# Altium project a0206-2006.PrjPcb (part 3 of 5)

## Sheet a0206-2006.9.SchDoc
size 558 x 431 mm
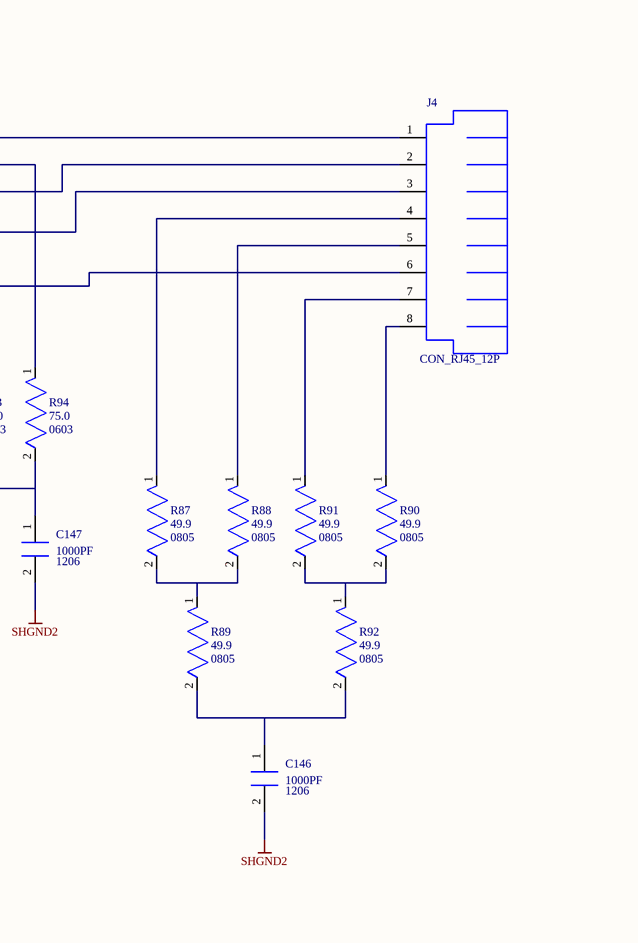
[diagram p27: a0206-2006.9.SchDoc, top right]
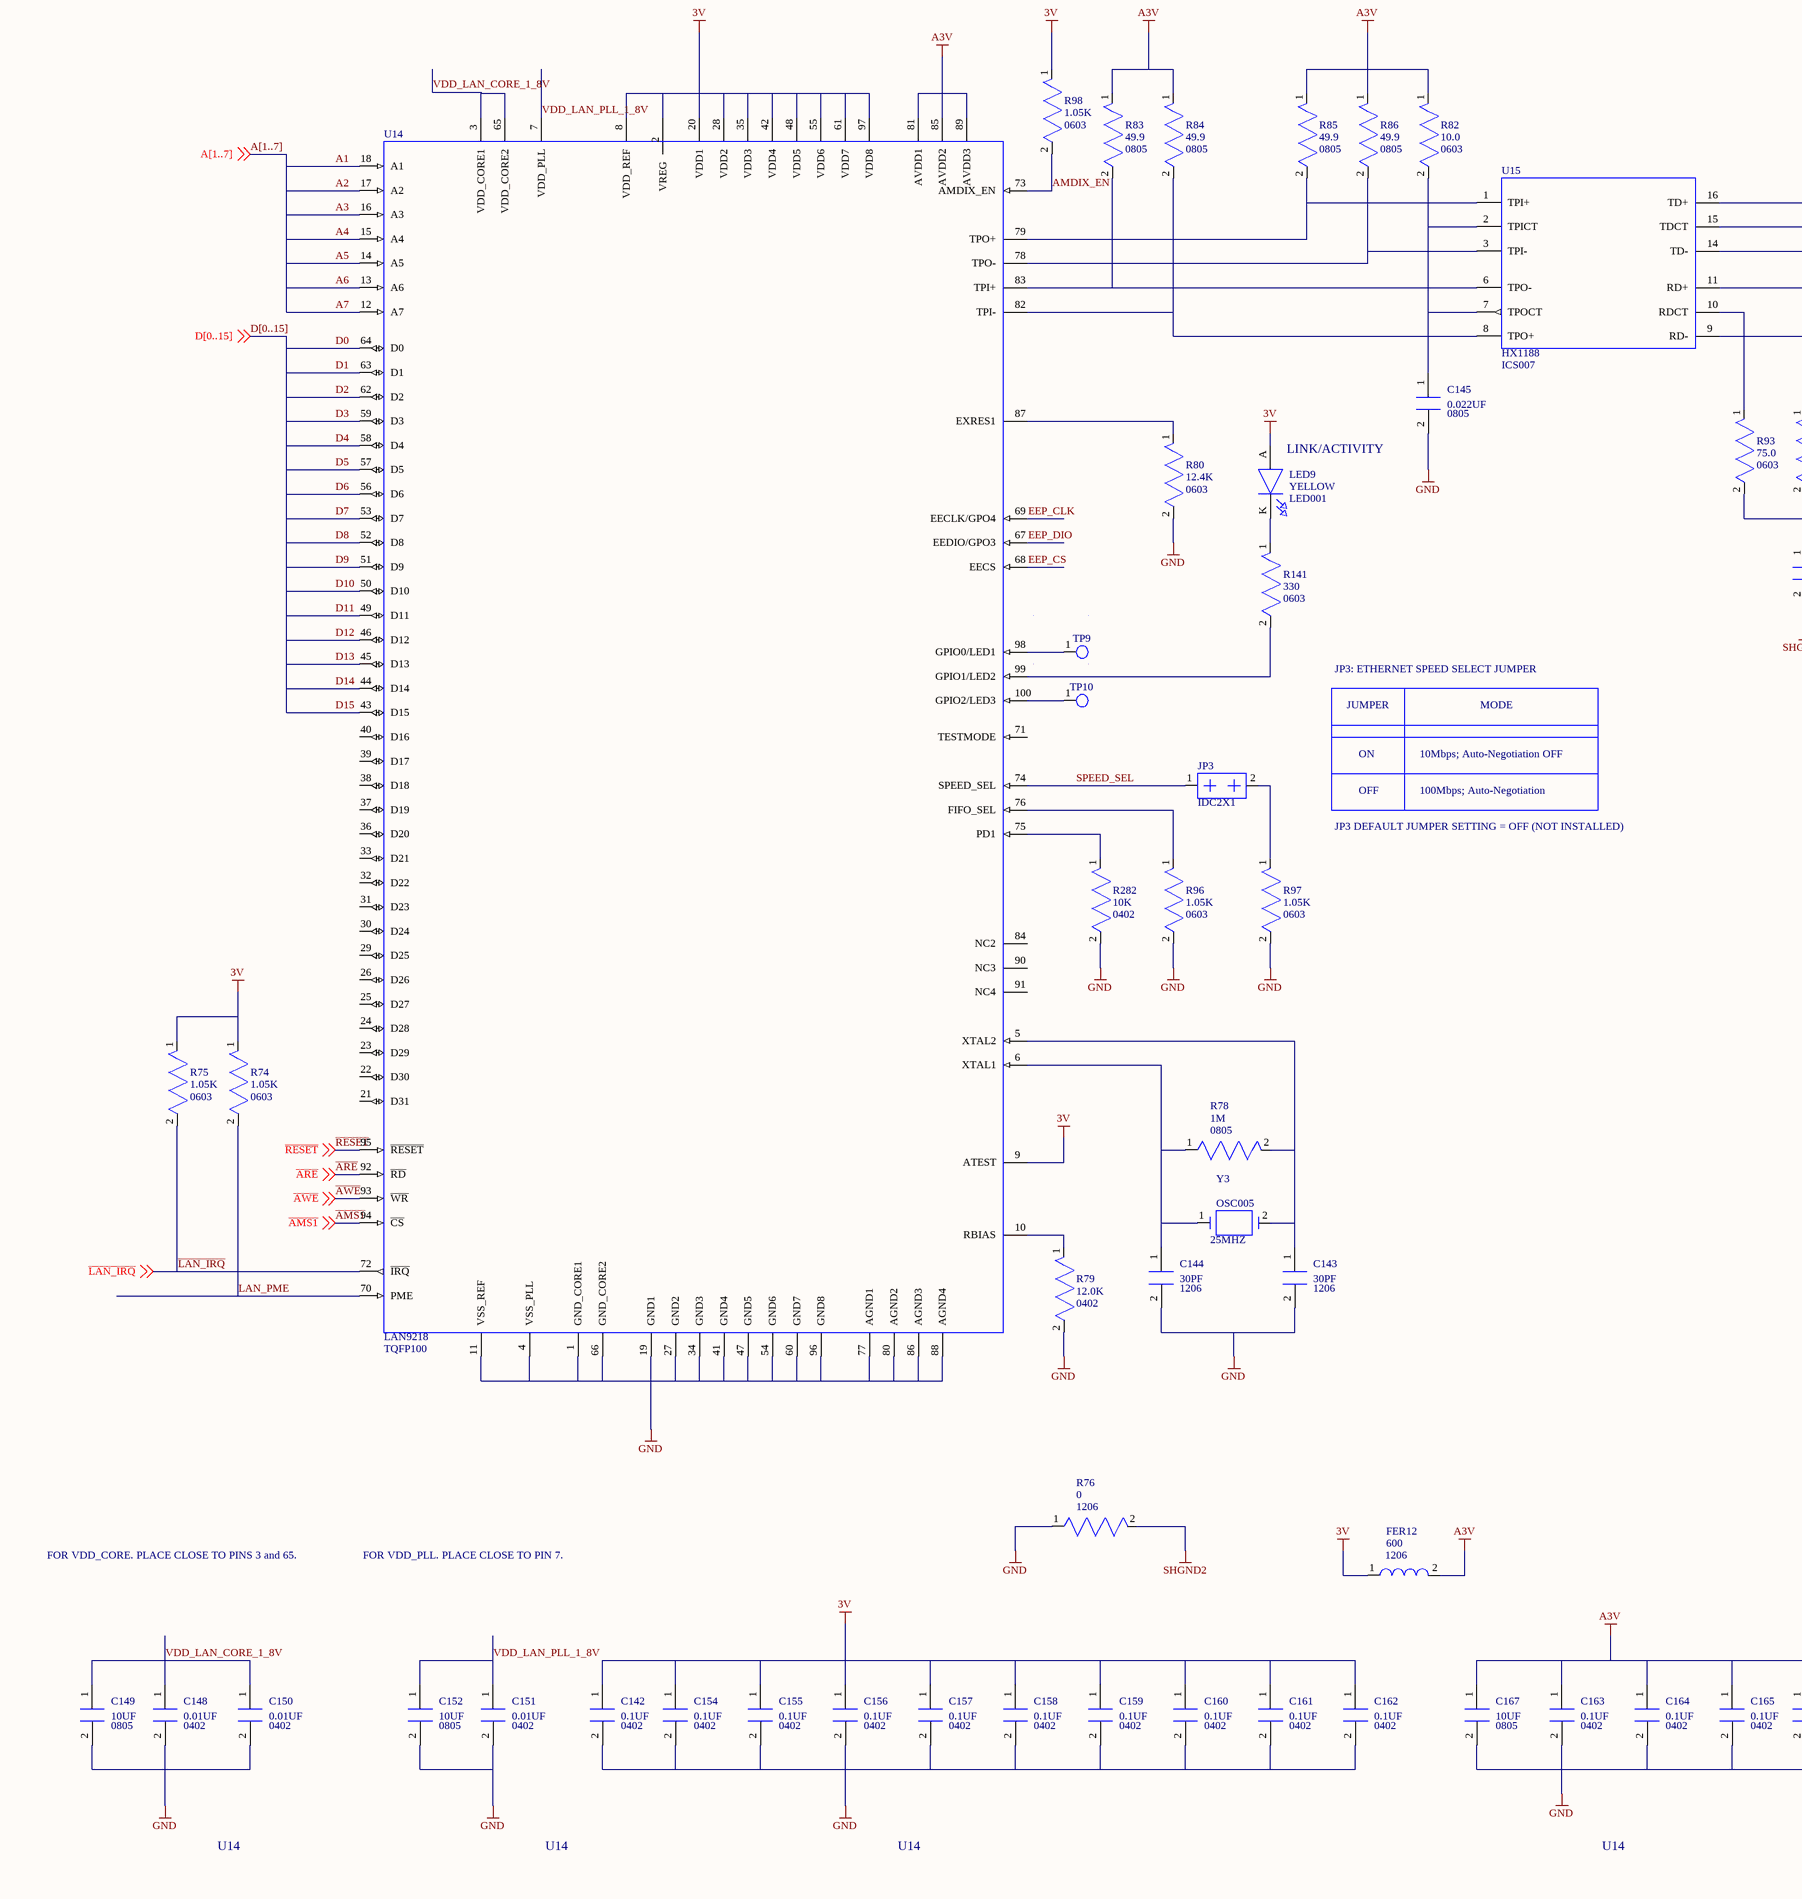
[diagram p28: a0206-2006.9.SchDoc, bottom left]
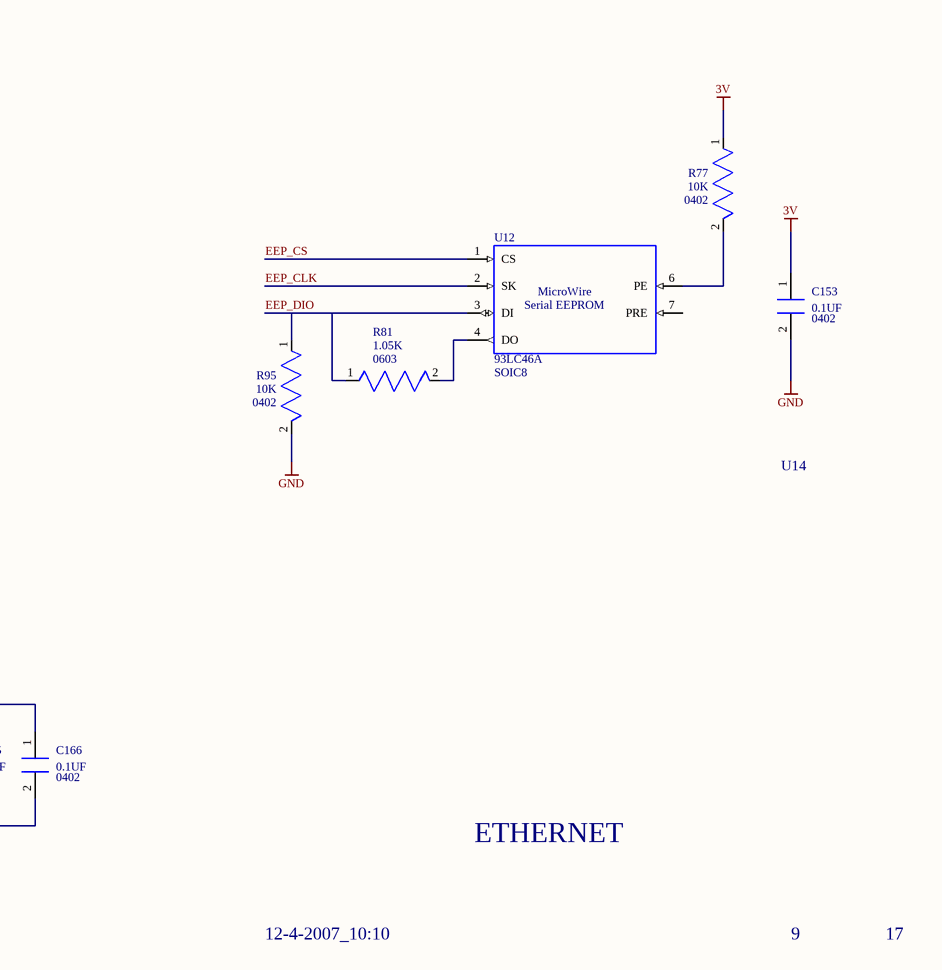
[diagram p29: a0206-2006.9.SchDoc, bottom right]

### Parts
C142  value 0.1UF  [0402]  (hidden comment: *)
C143  value 30PF  [1206]  (hidden comment: *)
C144  value 30PF  [1206]  (hidden comment: *)
C145  value 0.022UF  [0805]  (hidden comment: *)
C146  value 1000PF  [1206]  (hidden comment: *)
C147  value 1000PF  [1206]  (hidden comment: *)
C148  value 0.01UF  [0402]  (hidden comment: *)
C149  value 10UF  [0805]  (hidden comment: *)
C150  value 0.01UF  [0402]  (hidden comment: *)
C151  value 0.01UF  [0402]  (hidden comment: *)
C152  value 10UF  [0805]  (hidden comment: *)
C153  value 0.1UF  [0402]  (hidden comment: *)
C154  value 0.1UF  [0402]  (hidden comment: *)
C155  value 0.1UF  [0402]  (hidden comment: *)
C156  value 0.1UF  [0402]  (hidden comment: *)
C157  value 0.1UF  [0402]  (hidden comment: *)
C158  value 0.1UF  [0402]  (hidden comment: *)
C159  value 0.1UF  [0402]  (hidden comment: *)
C160  value 0.1UF  [0402]  (hidden comment: *)
C161  value 0.1UF  [0402]  (hidden comment: *)
C162  value 0.1UF  [0402]  (hidden comment: *)
C163  value 0.1UF  [0402]  (hidden comment: *)
C164  value 0.1UF  [0402]  (hidden comment: *)
C165  value 0.1UF  [0402]  (hidden comment: *)
C166  value 0.1UF  [0402]  (hidden comment: *)
C167  value 10UF  [0805]  (hidden comment: *)
FER12  value 600  [1206]  (hidden comment: *)
J4  *  [CON_RJ45_12P]  (value not drawn)
JP3  *  [IDC2X1]  (value not drawn)
LED9  value YELLOW  [LED001]  (hidden comment: *)
R74  value 1.05K  [0603]  (hidden comment: *)
R75  value 1.05K  [0603]  (hidden comment: *)
R76  value 0  [1206]  (hidden comment: *)
R77  value 10K  [0402]  (hidden comment: *)
R78  value 1M  [0805]  (hidden comment: *)
R79  value 12.0K  [0402]  (hidden comment: *)
R80  value 12.4K  [0603]  (hidden comment: *)
R81  value 1.05K  [0603]  (hidden comment: *)
R82  value 10.0  [0603]  (hidden comment: *)
R83  value 49.9  [0805]  (hidden comment: *)
R84  value 49.9  [0805]  (hidden comment: *)
R85  value 49.9  [0805]  (hidden comment: *)
R86  value 49.9  [0805]  (hidden comment: *)
R87  value 49.9  [0805]  (hidden comment: *)
R88  value 49.9  [0805]  (hidden comment: *)
R89  value 49.9  [0805]  (hidden comment: *)
R90  value 49.9  [0805]  (hidden comment: *)
R91  value 49.9  [0805]  (hidden comment: *)
R92  value 49.9  [0805]  (hidden comment: *)
R93  value 75.0  [0603]  (hidden comment: *)
R94  value 75.0  [0603]  (hidden comment: *)
R95  value 10K  [0402]  (hidden comment: *)
R96  value 1.05K  [0603]  (hidden comment: *)
R97  value 1.05K  [0603]  (hidden comment: *)
R98  value 1.05K  [0603]  (hidden comment: *)
R141  value 330  [0603]  (hidden comment: *)
R282  value 10K  [0402]  (hidden comment: *)
TP9  *  [TP]  (value not drawn)
TP10  *  [TP]  (value not drawn)
U12  PART: 93LC46A  [SOIC8]  (hidden comment: *)
U14  PART: LAN9218  [TQFP100]  (hidden comment: *)
U15  PART: HX1188  [ICS007]  (hidden comment: *)
Y3  value 25MHZ  [OSC005]  (hidden comment: *)

### Nets
3V: C142.1(A) C153.1(A) C154.1(A) C155.1(A) C156.1(A) C157.1(A) C158.1(A) C159.1(A) C160.1(A) C161.1(A) C162.1(A) FER12.1(A) LED9.A(ANODE) R74.1(N1) R75.1(N1) R77.1(N1) R98.1(N1) U12.8(3V) U14.2(VREG) U14.8(VDD_REF) U14.9(ATEST) U14.20(VDD1) U14.28(VDD2) U14.35(VDD3) U14.42(VDD4) U14.48(VDD5) U14.55(VDD6) U14.61(VDD7) U14.97(VDD8)
A3V: C163.1(A) C164.1(A) C165.1(A) C166.1(A) C167.1(A) FER12.2(B) R82.1(N1) R83.1(N1) R84.1(N1) R85.1(N1) R86.1(N1) U14.81(AVDD1) U14.85(AVDD2) U14.89(AVDD3)
GND: C142.2(B) C143.2(B) C144.2(B) C145.2(B) C148.2(B) C149.2(B) C150.2(B) C151.2(B) C152.2(B) C153.2(B) C154.2(B) C155.2(B) C156.2(B) C157.2(B) C158.2(B) C159.2(B) C160.2(B) C161.2(B) C162.2(B) C163.2(B) C164.2(B) C165.2(B) C166.2(B) C167.2(B) R76.1(N1) R79.2(N2) R80.2(N2) R95.2(N2) R96.2(N2) R97.2(N2) R282.2(N2) U12.5(GND) U14.1(GND_CORE1) U14.4(VSS_PLL) U14.11(VSS_REF) U14.19(GND1) U14.27(GND2) U14.34(GND3) U14.41(GND4) U14.47(GND5) U14.54(GND6) U14.60(GND7) U14.66(GND_CORE2) U14.77(AGND1) U14.80(AGND2) U14.86(AGND3) U14.88(AGND4) U14.96(GND8)
SHGND2: C146.2(B) C147.2(B) J4.11(SHGND2) J4.12(SHGND2) R76.2(N2)
A1: U14.18(A1)
A2: U14.17(A2)
A3: U14.16(A3)
A4: U14.15(A4)
A5: U14.14(A5)
A6: U14.13(A6)
A7: U14.12(A7)
~{AMS1}: U14.94(~{CS}) ; off-sheet ~{AMS1}
~{ARE}: U14.92(~{RD}) ; off-sheet ~{ARE}
~{AWE}: U14.93(~{WR}) ; off-sheet ~{AWE}
AMDIX_EN: R98.2(N2) U14.73(AMDIX_EN)
D0: U14.64(D0)
D1: U14.63(D1)
D2: U14.62(D2)
D3: U14.59(D3)
D4: U14.58(D4)
D5: U14.57(D5)
D6: U14.56(D6)
D7: U14.53(D7)
D8: U14.52(D8)
D9: U14.51(D9)
D10: U14.50(D10)
D11: U14.49(D11)
D12: U14.46(D12)
D13: U14.45(D13)
D14: U14.44(D14)
D15: U14.43(D15)
EEP_CLK: U12.2(SK) U14.69(EECLK/GPO4)
EEP_CS: U12.1(CS) U14.68(EECS)
EEP_DIO: R81.1(N1) R95.1(N1) U12.3(DI) U14.67(EEDIO/GPO3)
~{LAN_IRQ}: R75.2(N2) U14.72(~{IRQ}) ; off-sheet ~{LAN_IRQ}
LAN_PME: R74.2(N2) U14.70(PME)
~{RESET}: U14.95(~{RESET}) ; off-sheet ~{RESET}
SPEED_SEL: JP3.1 U14.74(SPEED_SEL)
VDD_LAN_CORE_1_8V: C148.1(A) C149.1(A) C150.1(A) U14.3(VDD_CORE1) U14.65(VDD_CORE2)
VDD_LAN_PLL_1_8V: C151.1(A) C152.1(A) U14.7(VDD_PLL)
NetC143_1: C143.1(A) R78.2(N2) U14.5(XTAL2) Y3.2(N2)
NetC144_1: C144.1(A) R78.1(N1) U14.6(XTAL1) Y3.1(N1)
NetC145_1: C145.1(A) R82.2(N2) U15.2(TPICT) U15.7(TPOCT)
NetC146_1: C146.1(A) R89.2(N2) R92.2(N2)
NetC147_1: C147.1(A) R93.2(N2) R94.2(N2)
NetJ4_1: J4.1 U15.16(TD+)
NetJ4_2: J4.2 U15.14(TD-)
NetJ4_3: J4.3 U15.11(RD+)
NetJ4_4: J4.4 R87.1(N1)
NetJ4_5: J4.5 R88.1(N1)
NetJ4_6: J4.6 U15.9(RD-)
NetJ4_7: J4.7 R91.1(N1)
NetJ4_8: J4.8 R90.1(N1)
NetJP3_2: JP3.2 R97.1(N1)
NetLED9_K: LED9.K(CATHODE) R141.1(N1)
NetR77_2: R77.2(N2) U12.6(PE)
NetR79_1: R79.1(N1) U14.10(RBIAS)
NetR80_1: R80.1(N1) U14.87(EXRES1)
NetR81_2: R81.2(N2) U12.4(DO)
NetR83_2: R83.2(N2) U14.83(TPI+) U15.6(TPO-)
NetR84_2: R84.2(N2) U14.82(TPI-) U15.8(TPO+)
NetR85_2: R85.2(N2) U14.79(TPO+) U15.1(TPI+)
NetR86_2: R86.2(N2) U14.78(TPO-) U15.3(TPI-)
NetR87_2: R87.2(N2) R88.2(N2) R89.1(N1)
NetR90_2: R90.2(N2) R91.2(N2) R92.1(N1)
NetR93_1: R93.1(N1) U15.10(RDCT)
NetR94_1: R94.1(N1) U15.15(TDCT)
NetR96_1: R96.1(N1) U14.76(FIFO_SEL)
NetR141_2: R141.2(N2) U14.99(GPIO1/LED2)
NetR282_1: R282.1(N1) U14.75(PD1)
NetTP9_1: TP9.1(TP) U14.98(GPIO0/LED1)
NetTP10_1: TP10.1(TP) U14.100(GPIO2/LED3)

Not connected (* = marked no-connect by the designer): J4 9 10; U12 7(PRE); U14 21(D31) 22(D30) 23(D29) 24(D28) 25(D27) 26(D26) 29(D25) 30(D24) 31(D23) 32(D22) 33(D21) 36(D20) 37(D19) 38(D18) 39(D17) 40(D16) 71(TESTMODE) 84(NC2) 90(NC3) 91(NC4); U15 4 5 12 13

### Buses and harness runs
bus A[1..7]
bus D[0..15]

### Notes on the sheet
- (near LED9) LINK/ACTIVITY
- JP3: ETHERNET SPEED SELECT JUMPER
- JUMPER
- MODE
- OFF
- ON
- 10Mbps; Auto-Negotiation OFF
- 100Mbps; Auto-Negotiation
- JP3 DEFAULT JUMPER SETTING = OFF (NOT INSTALLED)
- U14
- FOR VDD_CORE. PLACE CLOSE TO PINS 3 and 65.
- FOR VDD_PLL. PLACE CLOSE TO PIN 7.
- ETHERNET
- 12-4-2007_10:10
- 9
- 17
- A
- B
- C
- D
- 1
- 2
- 3
- 20 Cotton Road
- 4
- DEVICES
- ANALOG
- Nashua, NH 03063
- PH: 1-800-ANALOGD
- Title
- ADSP-BF548 EZ-KIT LITE
- Size
- Board No.
- A0206-2006
- Rev
- 1.4B
- Date
- Sheet
- of
- (in symbol ICS_93CSXXL.1) MicroWire; Serial EEPROM

### Library data of the parts
C142 C155 C157 C159 C161 C163 C165 = CAP_NON_POLARIZED.2: PART_SPEC: CAPACITOR; LEVEL: STD; TYPE: X5R; PRT_NUM: 7000278; VOLTAGE: 10V; TOLERANCE: 10%; PKG_TYPE: 0402; ROHS: ROHS
C143 C144 = CAP_NON_POLARIZED.2: PART_SPEC: CAPACITOR; LEVEL: STD; TYPE: NPO; PRT_NUM: 7000150; VOLTAGE: 100V; TOLERANCE: 5%; PKG_TYPE: 1206; ROHS: ROHS
C145 = CAP_NON_POLARIZED.2: PART_SPEC: CAPACITOR; LEVEL: STD; PRT_NUM: 7000331; TYPE: X7R; VOLTAGE: 50V; TOLERANCE: 5%; PKG_TYPE: 0805; ROHS: ROHS
C146 = CAP_NON_POLARIZED.2: PART_SPEC: CAPACITOR; LEVEL: STD; PRT_NUM: 7000572; TOLERANCE: 10%; VOLTAGE: 2000V; TYPE: X7R LOW_ESR; PKG_TYPE: 1206; ROHS: ROHS
C147 = CAP_NON_POLARIZED.2: PART_SPEC: CAPACITOR; LEVEL: STD; PRT_NUM: 7000572; TYPE: X7R LOW_ESR; VOLTAGE: 2000V; TOLERANCE: 10%; PKG_TYPE: 1206; ROHS: ROHS
C148 = CAP_NON_POLARIZED.2: PART_SPEC: CAPACITOR; LEVEL: STD; PRT_NUM: 7000279; VOLTAGE: 16V; TOLERANCE: 10%; TYPE: X7R; PKG_TYPE: 0402; ROHS: ROHS
C149 = CAP_NON_POLARIZED.2: PART_SPEC: CAPACITOR; LEVEL: STD; TOLERANCE: 10%; VOLTAGE: 6.3V; PRT_NUM: 7000265; TYPE: X5R; PKG_TYPE: 0805; ROHS: ROHS
C150 C151 = CAP_NON_POLARIZED.2: PART_SPEC: CAPACITOR; LEVEL: STD; TYPE: X7R; TOLERANCE: 10%; VOLTAGE: 16V; PRT_NUM: 7000279; PKG_TYPE: 0402; ROHS: ROHS
C152 C167 = CAP_NON_POLARIZED.2: PART_SPEC: CAPACITOR; LEVEL: STD; TYPE: X5R; PRT_NUM: 7000265; VOLTAGE: 6.3V; TOLERANCE: 10%; PKG_TYPE: 0805; ROHS: ROHS
C153 = CAP_NON_POLARIZED.2: PART_SPEC: CAPACITOR; LEVEL: STD; PRT_NUM: 7000278; VOLTAGE: 10V; TOLERANCE: 10%; TYPE: X5R; PKG_TYPE: 0402; ROHS: ROHS
C154 C156 C158 C160 C162 C164 C166 = CAP_NON_POLARIZED.2: PART_SPEC: CAPACITOR; LEVEL: STD; TOLERANCE: 10%; VOLTAGE: 10V; PRT_NUM: 7000278; TYPE: X5R; PKG_TYPE: 0402; ROHS: ROHS
FER12 = FER_STANDARD.1: PART_SPEC: FERRITE; LEVEL: STD; FREQ: 100MHZ; PRT_NUM: 7000117; CURRENT: 500MA; PKG_TYPE: 1206; ROHS: ROHS
J4 = CON_RJ45_12P.1: RA; PART_SPEC: CONNECTOR; LEVEL: STD; NC: 9,10; CONFIGURATION: 8PIN; PRT_NUM: 6000830; PKG_TYPE: CON_RJ45_12P; ROHS: ROHS; TYPE: RJ45
JP3 = CON_2X1.2: HEADER; PART_SPEC: CONNECTOR; LEVEL: STD; PRT_NUM: 6000774; CONFIGURATION: 2X1; PKG_TYPE: IDC2X1; TYPE: IDC; ROHS: ROHS
LED9 = LED_STANDARD.3: GULL-WING; PART_SPEC: LED; LEVEL: STD; PD1: AMBER-SMT; PRT_NUM: 7000027; PKG_TYPE: LED001; ROHS: ROHS
R74 = RES_STANDARD.2: PART_SPEC: RESISTOR; LEVEL: STD; POWER: 1/16W; PRT_NUM: 7000458; TOLERANCE: 1%; PKG_TYPE: 0603; ROHS: ROHS
R75 R96 R98 = RES_STANDARD.2: PART_SPEC: RESISTOR; LEVEL: STD; POWER: 1/16W; TOLERANCE: 1%; PRT_NUM: 7000458; PKG_TYPE: 0603; ROHS: ROHS
R76 = RES_STANDARD.1: PART_SPEC: RESISTOR; LEVEL: STD; POWER: 1/4W; PRT_NUM: 7000021; TOLERANCE: 5%; PKG_TYPE: 1206; ROHS: ROHS
R77 = RES_STANDARD.2: PART_SPEC: RESISTOR; LEVEL: STD; POWER: 1/16W; TOLERANCE: 5%; PRT_NUM: 7000280; PKG_TYPE: 0402; ROHS: ROHS
R78 = RES_STANDARD.1: PART_SPEC: RESISTOR; LEVEL: STD; POWER: 1/10W; PRT_NUM: 7000046; TOLERANCE: 5%; PKG_TYPE: 0805; ROHS: ROHS
R79 = RES_STANDARD.2: PART_SPEC: RESISTOR; LEVEL: STD; PRT_NUM: 7000543; TOLERANCE: 1%; POWER: 1/16W; PKG_TYPE: 0402; ROHS: ROHS
R80 = RES_STANDARD.2: PART_SPEC: RESISTOR; LEVEL: STD; PRT_NUM: 7000410; POWER: 1/10W; TOLERANCE: 1%; PKG_TYPE: 0603; ROHS: ROHS
R81 = RES_STANDARD.1: PART_SPEC: RESISTOR; LEVEL: STD; TOLERANCE: 1%; PRT_NUM: 7000458; POWER: 1/16W; PKG_TYPE: 0603; ROHS: ROHS
R82 = RES_STANDARD.2: PART_SPEC: RESISTOR; LEVEL: STD; PRT_NUM: 7000580; POWER: 1/10W; TOLERANCE: 1%; PKG_TYPE: 0603; ROHS: ROHS
R83 R85 R87 R89 R90 = RES_STANDARD.2: PART_SPEC: RESISTOR; LEVEL: STD; TOLERANCE: 1%; PRT_NUM: 7000335; POWER: 1/10W; PKG_TYPE: 0805; ROHS: ROHS
R84 R86 R88 R91 R92 = RES_STANDARD.2: PART_SPEC: RESISTOR; LEVEL: STD; POWER: 1/10W; PRT_NUM: 7000335; TOLERANCE: 1%; PKG_TYPE: 0805; ROHS: ROHS
R93 = RES_STANDARD.2: PART_SPEC: RESISTOR; LEVEL: STD; PRT_NUM: 7000417; POWER: 1/10W; TOLERANCE: 1%; PKG_TYPE: 0603; ROHS: ROHS
R94 = RES_STANDARD.2: PART_SPEC: RESISTOR; LEVEL: STD; TOLERANCE: 1%; POWER: 1/10W; PRT_NUM: 7000417; PKG_TYPE: 0603; ROHS: ROHS
R95 = RES_STANDARD.2: PART_SPEC: RESISTOR; LEVEL: STD; PRT_NUM: 7000280; TOLERANCE: 5%; POWER: 1/16W; PKG_TYPE: 0402; ROHS: ROHS
R97 = RES_STANDARD.2: PART_SPEC: RESISTOR; LEVEL: STD; PRT_NUM: 7000458; TOLERANCE: 1%; POWER: 1/16W; PKG_TYPE: 0603; ROHS: ROHS
R141 = RES_STANDARD.2: PART_SPEC: RESISTOR; LEVEL: STD; POWER: 1/10W; PRT_NUM: 7000368; TOLERANCE: 5%; PKG_TYPE: 0603; ROHS: ROHS
R282 = RES_STANDARD.2: as R56 on sheet a0206-2006.7; PKG_TYPE: 0402; ROHS: ROHS
TP9 TP10 = MSC_TEST_POINT.2: TESTPOINT; CLASS: DNP; LEVEL: STD; PART_SPEC: TESTPOINT; PART: TESTPOINT; ROHS: ROHS; PKG_TYPE: TP
U12 = ICS_93CSXXL.1: 1K (128X8) SERIAL ROM; LEVEL: STD; PRT_NUM: 1000444; PKG_TYPE: SOIC8; WEB: http://ww1.microchip.com/downloads/en/DeviceDoc/21749F.pdf; ROHS: ROHS
U14 = ICS_LAN9218.1: 10/100 ETHERNET CONTROLLE; LEVEL: STD; PRT_NUM: 1000421; PKG_TYPE: TQFP100; ROHS: ROHS; WEB: http://www.smsc.com/main/catalog/lan9218.html
U15 = ICS_HX1188.1: MAGNETIC FOR ETHERNET; NC: 4,5,12,13; LEVEL: STD; PRT_NUM: 1000420; PKG_TYPE: ICS007; ROHS: ROHS; WEB: http://www.pulseeng.com/products/datasheets/H325.pdf
Y3 = OSC_CRYSTAL.1: CRYSTAL; LEVEL: STD; PD2: SMT; PRT_NUM: 1000139; PART_SPEC: CRYSTAL; PKG_TYPE: OSC005; ROHS: ROHS; VOLTAGE: SMT

## Sheet a0206-2006.10.SchDoc
size 558 x 431 mm
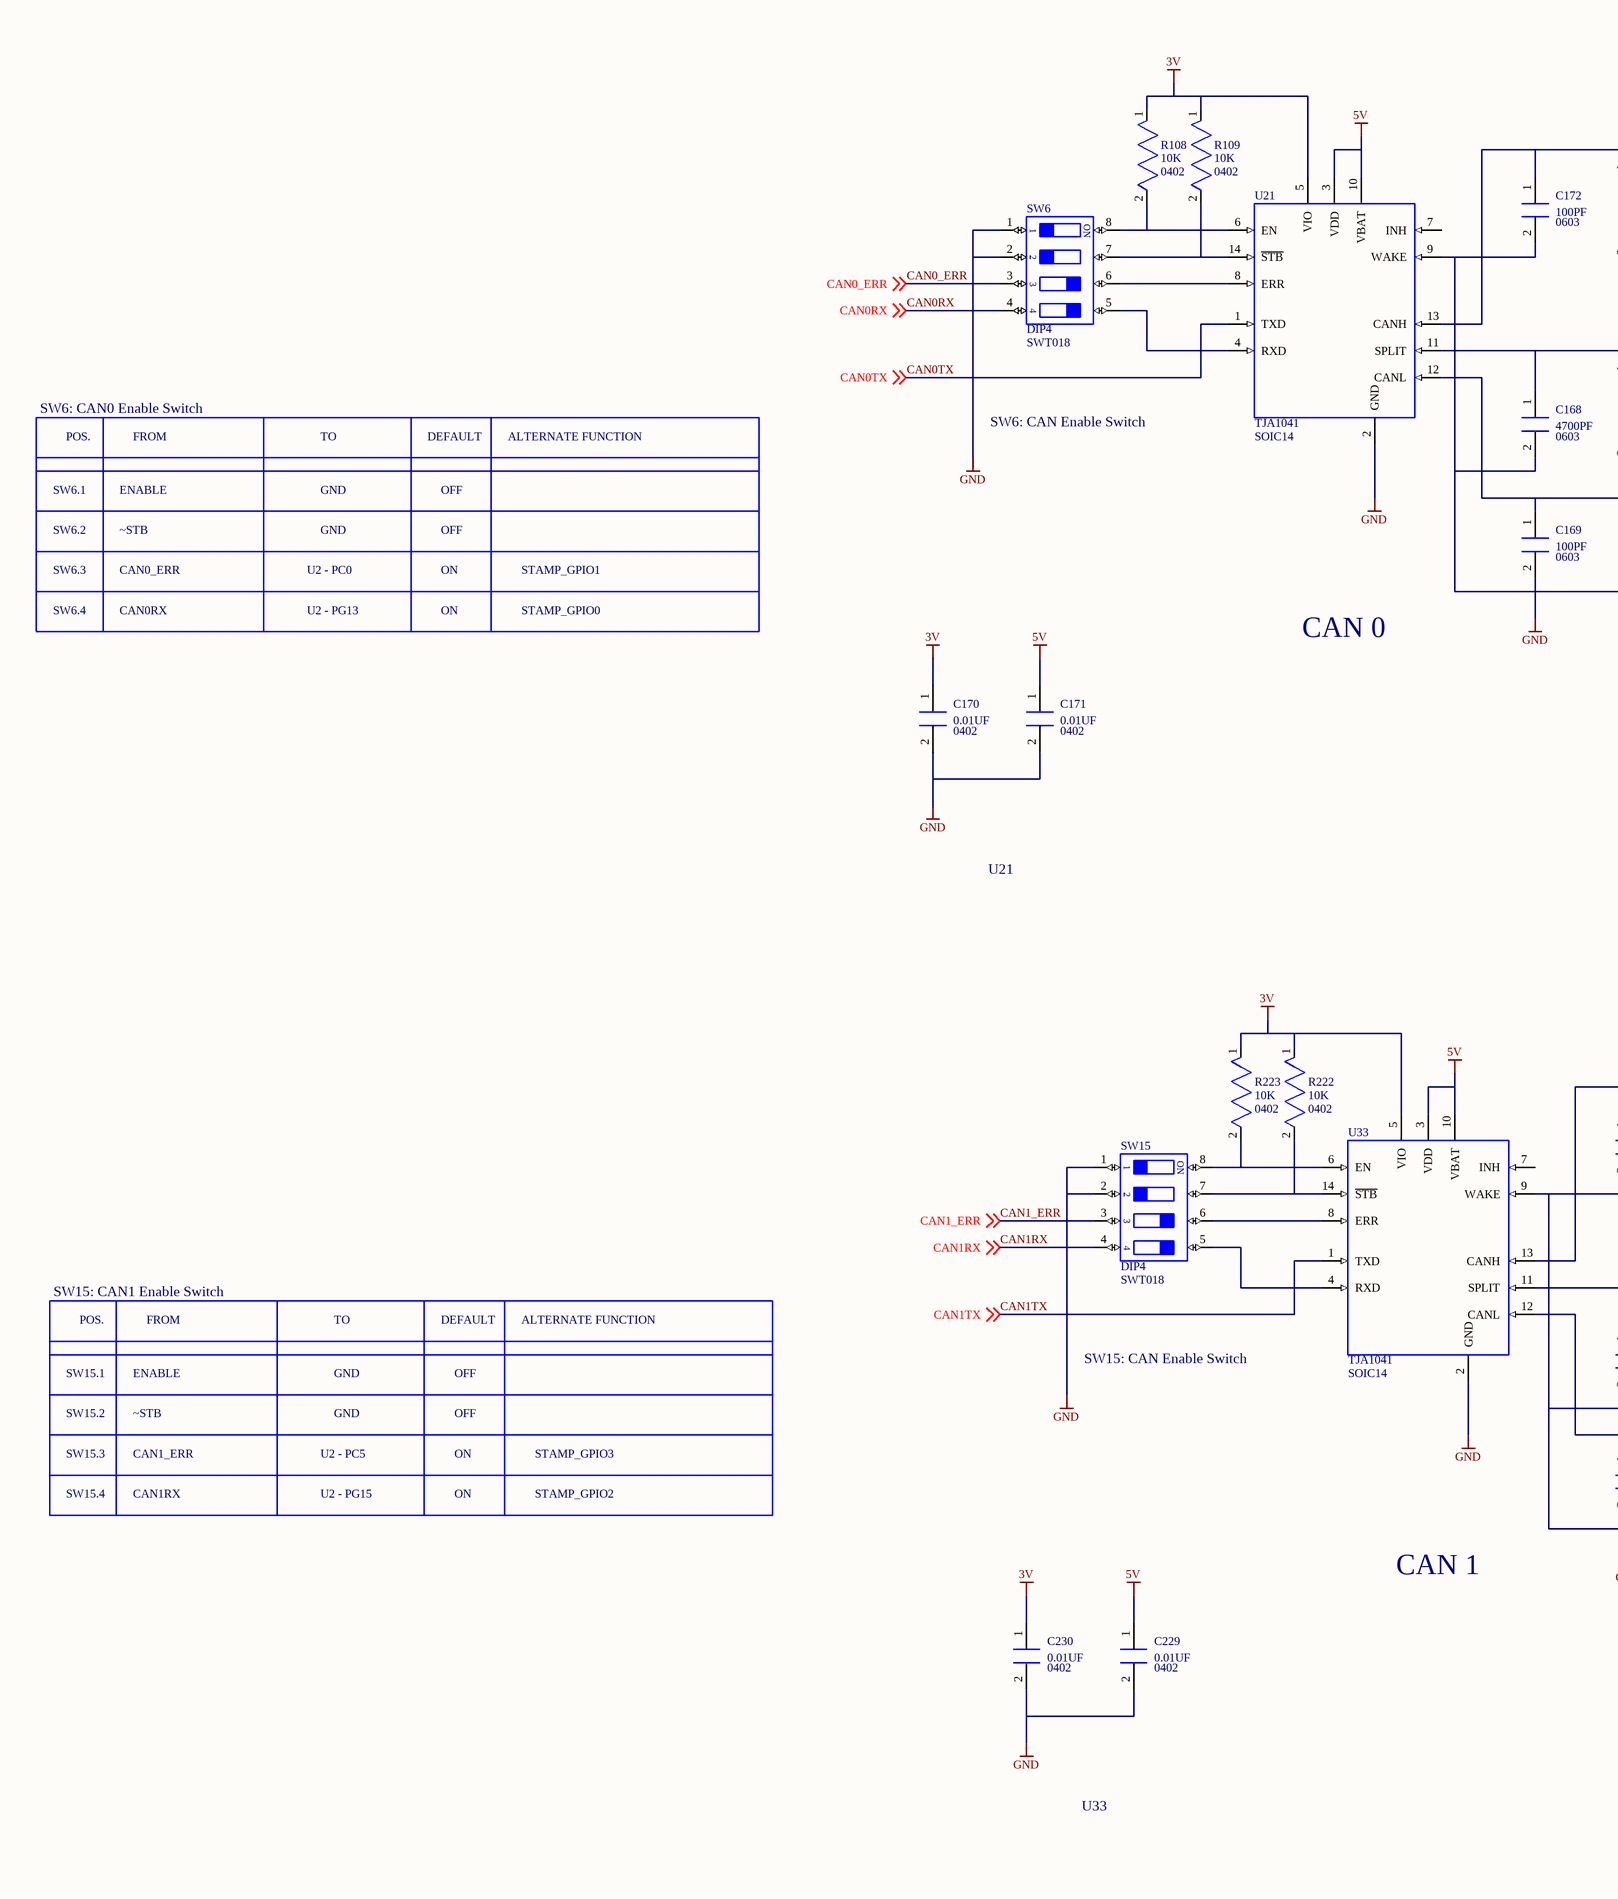
[diagram p30: a0206-2006.10.SchDoc, left]
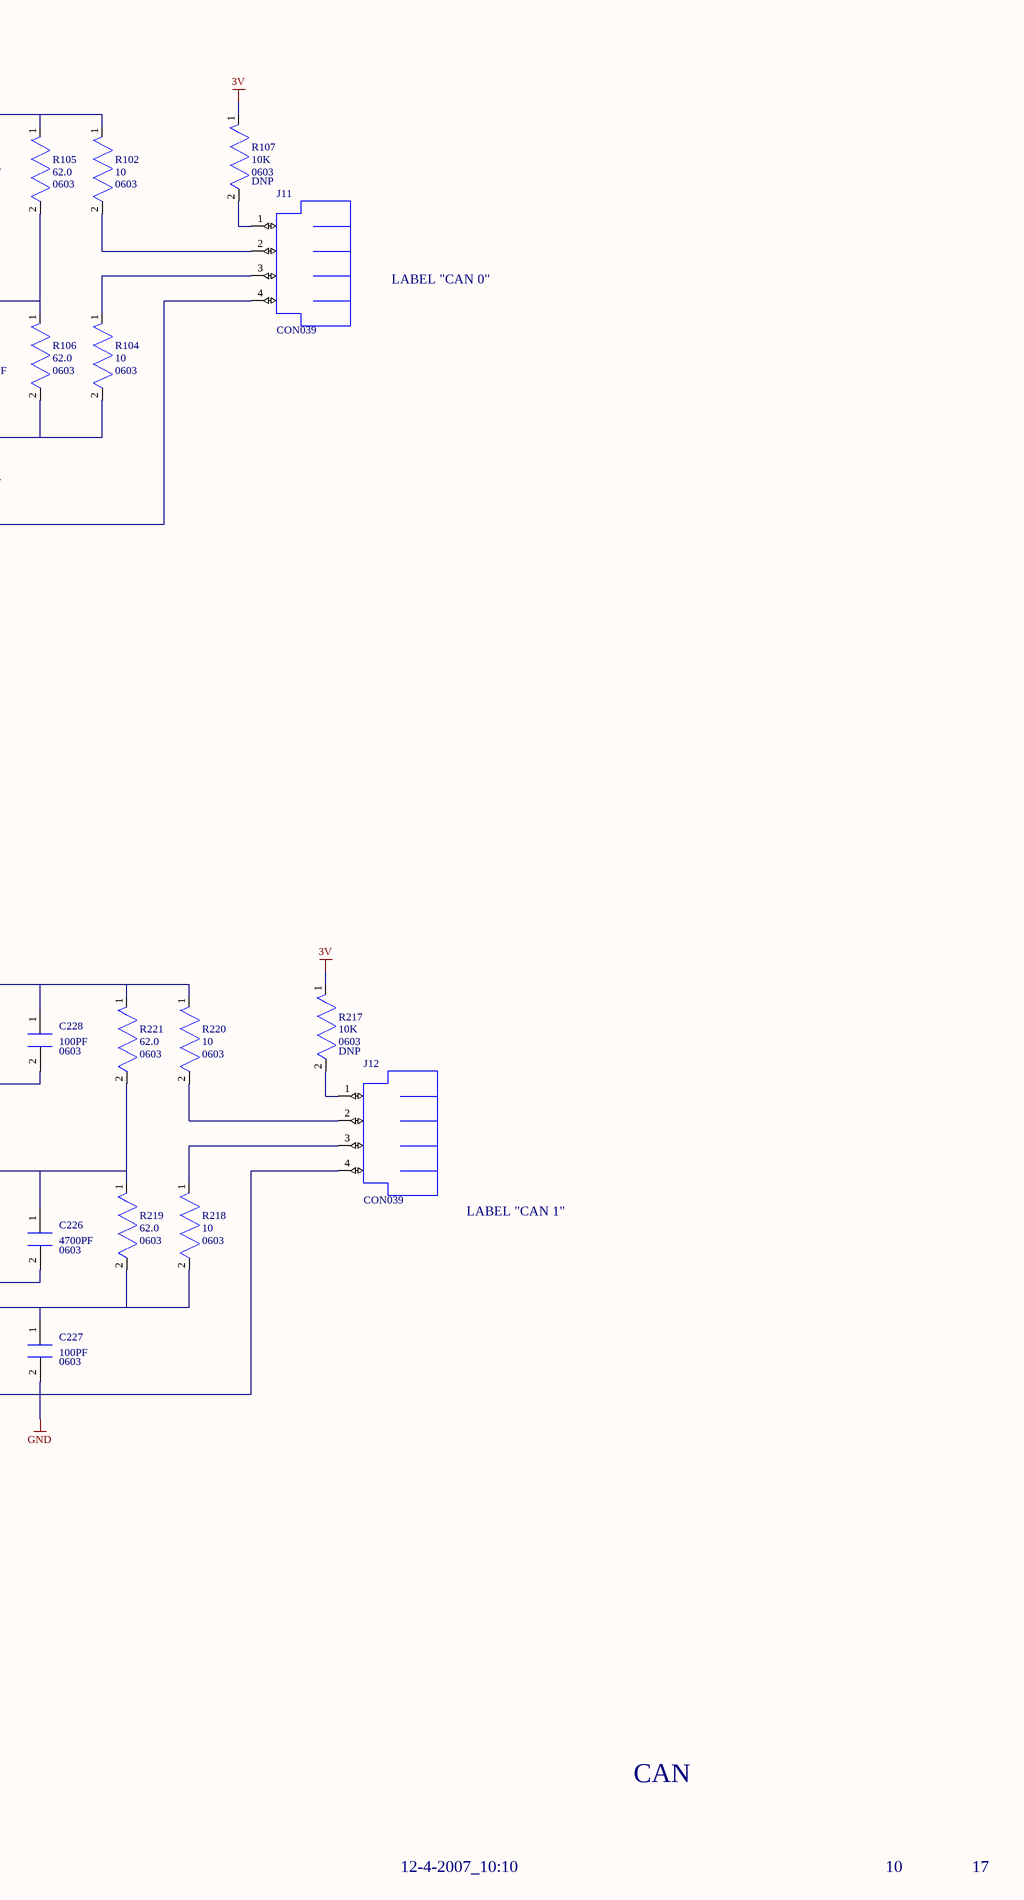
[diagram p31: a0206-2006.10.SchDoc, right]

### Parts
C168  value 4700PF  [0603]  (hidden comment: *)
C169  value 100PF  [0603]  (hidden comment: *)
C170  value 0.01UF  [0402]  (hidden comment: *)
C171  value 0.01UF  [0402]  (hidden comment: *)
C172  value 100PF  [0603]  (hidden comment: *)
C226  value 4700PF  [0603]  (hidden comment: *)
C227  value 100PF  [0603]  (hidden comment: *)
C228  value 100PF  [0603]  (hidden comment: *)
C229  value 0.01UF  [0402]  (hidden comment: *)
C230  value 0.01UF  [0402]  (hidden comment: *)
J11  *  [CON039]  (value not drawn)
J12  *  [CON039]  (value not drawn)
R102  value 10  [0603]  (hidden comment: *)
R104  value 10  [0603]  (hidden comment: *)
R105  value 62.0  [0603]  (hidden comment: *)
R106  value 62.0  [0603]  (hidden comment: *)
R107  value 10K  CLASS: DNP  [0603]  (hidden comment: *)
R108  value 10K  [0402]  (hidden comment: *)
R109  value 10K  [0402]  (hidden comment: *)
R217  value 10K  CLASS: DNP  [0603]  (hidden comment: *)
R218  value 10  [0603]  (hidden comment: *)
R219  value 62.0  [0603]  (hidden comment: *)
R220  value 10  [0603]  (hidden comment: *)
R221  value 62.0  [0603]  (hidden comment: *)
R222  value 10K  [0402]  (hidden comment: *)
R223  value 10K  [0402]  (hidden comment: *)
SW6  value DIP4  [SWT018]  (hidden comment: *)
SW15  value DIP4  [SWT018]  (hidden comment: *)
U21  PART: TJA1041  [SOIC14]  (hidden comment: *)
U33  PART: TJA1041  [SOIC14]  (hidden comment: *)

### Nets
3V: C170.1(A) C230.1(A) R107.1(N1) R108.1(N1) R109.1(N1) R217.1(N1) R222.1(N1) R223.1(N1) U21.5(VIO) U33.5(VIO)
5V: C171.1(A) C229.1(A) U21.3(VDD) U21.10(VBAT) U33.3(VDD) U33.10(VBAT)
GND: C168.2(B) C169.2(B) C170.2(B) C171.2(B) C172.2(B) C226.2(B) C227.2(B) C228.2(B) C229.2(B) C230.2(B) J11.4 J12.4 SW6.1 SW6.2 SW15.1 SW15.2 U21.2(GND) U21.9(WAKE) U33.2(GND) U33.9(WAKE)
CAN0_ERR: SW6.3 ; off-sheet CAN0_ERR
CAN0RX: SW6.4 ; off-sheet CAN0RX
CAN0TX: U21.1(TXD) ; off-sheet CAN0TX
CAN1_ERR: SW15.3 ; off-sheet CAN1_ERR
CAN1RX: SW15.4 ; off-sheet CAN1RX
CAN1TX: U33.1(TXD) ; off-sheet CAN1TX
NetC168_1: C168.1(A) R105.2(N2) R106.1(N1) U21.11(SPLIT)
NetC169_1: C169.1(A) R104.2(N2) R106.2(N2) U21.12(CANL)
NetC172_1: C172.1(A) R102.1(N1) R105.1(N1) U21.13(CANH)
NetC226_1: C226.1(A) R219.1(N1) R221.2(N2) U33.11(SPLIT)
NetC227_1: C227.1(A) R218.2(N2) R219.2(N2) U33.12(CANL)
NetC228_1: C228.1(A) R220.1(N1) R221.1(N1) U33.13(CANH)
NetJ11_1: J11.1 R107.2(N2)
NetJ11_2: J11.2 R102.2(N2)
NetJ11_3: J11.3 R104.1(N1)
NetJ12_1: J12.1 R217.2(N2)
NetJ12_2: J12.2 R220.2(N2)
NetJ12_3: J12.3 R218.1(N1)
NetR108_2: R108.2(N2) SW6.8 U21.6(EN)
NetR109_2: R109.2(N2) SW6.7 U21.14(~{STB})
NetR222_2: R222.2(N2) SW15.7 U33.14(~{STB})
NetR223_2: R223.2(N2) SW15.8 U33.6(EN)
NetSW6_5: SW6.5 U21.4(RXD)
NetSW6_6: SW6.6 U21.8(ERR)
NetSW15_5: SW15.5 U33.4(RXD)
NetSW15_6: SW15.6 U33.8(ERR)

Not connected (* = marked no-connect by the designer): U21 7(INH); U33 7(INH)

### Notes on the sheet
- LABEL "CAN 0"
- SW6: CAN0 Enable Switch
- POS.
- FROM
- TO
- DEFAULT
- ALTERNATE FUNCTION
- SW6: CAN Enable Switch
- SW6.1
- ENABLE
- GND
- OFF
- SW6.2
- SW6.3
- ~STB
- CAN0_ERR
- U2 - PC0
- ON
- STAMP_GPIO1
- SW6.4
- CAN0RX
- U2 - PG13
- STAMP_GPIO0
- CAN 0
- U21
- SW15: CAN1 Enable Switch
- SW15.1
- SW15: CAN Enable Switch
- LABEL "CAN 1"
- SW15.2
- SW15.3
- CAN1_ERR
- U2 - PC5
- STAMP_GPIO3
- SW15.4
- CAN1RX
- U2 - PG15
- STAMP_GPIO2
- CAN 1
- U33
- CAN
- 12-4-2007_10:10
- 10
- 17
- A
- B
- C
- D
- 1
- 2
- 3
- 20 Cotton Road
- 4
- DEVICES
- ANALOG
- Nashua, NH 03063
- PH: 1-800-ANALOGD
- Title
- ADSP-BF548 EZ-KIT LITE
- Size
- Board No.
- A0206-2006
- Rev
- 1.4B
- Date
- Sheet
- of
- (in symbol SW_DIP4.1) ON

### Library data of the parts
C168 = CAP_NON_POLARIZED.2: PART_SPEC: CAPACITOR; LEVEL: STD; TYPE: X7R; PRT_NUM: 7000387; BOARDS: BOTH; VOLTAGE: 16V; TOLERANCE: 10%; PKG_TYPE: 0603; ROHS: ROHS
C169 C172 = CAP_NON_POLARIZED.2: PART_SPEC: CAPACITOR; LEVEL: STD; TYPE: NPO; BOARDS: BOTH; TOLERANCE: 5%; VOLTAGE: 50V; PRT_NUM: 7000405; PKG_TYPE: 0603; ROHS: ROHS
C170 = CAP_NON_POLARIZED.2: PART_SPEC: CAPACITOR; LEVEL: STD; TYPE: X7R; BOARDS: BOTH; PRT_NUM: 7000279; VOLTAGE: 16V; TOLERANCE: 10%; PKG_TYPE: 0402; ROHS: ROHS
C171 = CAP_NON_POLARIZED.2: PART_SPEC: CAPACITOR; LEVEL: STD; TYPE: X7R; BOARDS: BOTH; TOLERANCE: 10%; VOLTAGE: 16V; PRT_NUM: 7000279; PKG_TYPE: 0402; ROHS: ROHS
C226 = CAP_NON_POLARIZED.2: PART_SPEC: CAPACITOR; LEVEL: STD; TOLERANCE: 10%; VOLTAGE: 16V; BOARDS: BOTH; PRT_NUM: 7000387; TYPE: X7R; PKG_TYPE: 0603; ROHS: ROHS
C227 C228 = CAP_NON_POLARIZED.2: PART_SPEC: CAPACITOR; LEVEL: STD; PRT_NUM: 7000405; VOLTAGE: 50V; TOLERANCE: 5%; BOARDS: BOTH; TYPE: NPO; PKG_TYPE: 0603; ROHS: ROHS
C229 = CAP_NON_POLARIZED.2: as C196 on sheet a0206-2006.8; PKG_TYPE: 0402; ROHS: ROHS
C230 = CAP_NON_POLARIZED.2: PART_SPEC: CAPACITOR; LEVEL: STD; TOLERANCE: 10%; VOLTAGE: 16V; PRT_NUM: 7000279; BOARDS: BOTH; TYPE: X7R; PKG_TYPE: 0402; ROHS: ROHS
J11 = CON_RJ10.1: VERTICAL; LEVEL: STD; CONFIGURATION: 4PIN; PRT_NUM: 6000762; BOARDS: BOTH; TYPE: RJ11; PKG_TYPE: CON039; ROHS: ROHS
J12 = CON_RJ10.1: VERTICAL; LEVEL: STD; BOARDS: BOTH; PRT_NUM: 6000762; CONFIGURATION: 4PIN; TYPE: RJ11; PKG_TYPE: CON039; ROHS: ROHS
R102 = RES_STANDARD.2: PART_SPEC: RESISTOR; LEVEL: STD; POWER: 1/10W; BOARDS: BOTH; TOLERANCE: 5%; PRT_NUM: 7000374; PKG_TYPE: 0603; ROHS: ROHS
R104 = RES_STANDARD.2: PART_SPEC: RESISTOR; LEVEL: STD; POWER: 1/10W; BOARDS: BOTH; PRT_NUM: 7000374; TOLERANCE: 5%; PKG_TYPE: 0603; ROHS: ROHS
R105 R106 = RES_STANDARD.2: PART_SPEC: RESISTOR; LEVEL: STD; POWER: 1/10W; PRT_NUM: 7000411; BOARDS: BOTH; TOLERANCE: 1%; PKG_TYPE: 0603; ROHS: ROHS
R107 = RES_STANDARD.2: PART_SPEC: RESISTOR; LEVEL: STD; POWER: 1/10W; PRT_NUM: 7000364; BOARDS: BOTH; TOLERANCE: 5%; PKG_TYPE: 0603; ROHS: ROHS
R108 = RES_STANDARD.2: as R26 on sheet a0206-2006.8; PKG_TYPE: 0402; ROHS: ROHS
R109 = RES_STANDARD.2: PART_SPEC: RESISTOR; LEVEL: STD; POWER: 1/16W; BOARDS: BOTH; PRT_NUM: 7000280; TOLERANCE: 5%; PKG_TYPE: 0402; ROHS: ROHS
R217 = RES_STANDARD.2: PART_SPEC: RESISTOR; LEVEL: STD; TOLERANCE: 5%; BOARDS: BOTH; PRT_NUM: 7000364; POWER: 1/10W; PKG_TYPE: 0603; ROHS: ROHS
R218 = RES_STANDARD.2: PART_SPEC: RESISTOR; LEVEL: STD; TOLERANCE: 5%; PRT_NUM: 7000374; BOARDS: BOTH; POWER: 1/10W; PKG_TYPE: 0603; ROHS: ROHS
R219 R221 = RES_STANDARD.2: PART_SPEC: RESISTOR; LEVEL: STD; TOLERANCE: 1%; BOARDS: BOTH; PRT_NUM: 7000411; POWER: 1/10W; PKG_TYPE: 0603; ROHS: ROHS
R220 = RES_STANDARD.2: PART_SPEC: RESISTOR; LEVEL: STD; PRT_NUM: 7000374; TOLERANCE: 5%; BOARDS: BOTH; POWER: 1/10W; PKG_TYPE: 0603; ROHS: ROHS
R222 = RES_STANDARD.2: PART_SPEC: RESISTOR; LEVEL: STD; TOLERANCE: 5%; PRT_NUM: 7000280; BOARDS: BOTH; POWER: 1/16W; PKG_TYPE: 0402; ROHS: ROHS
R223 = RES_STANDARD.2: as R62 on sheet a0206-2006.8; PKG_TYPE: 0402; ROHS: ROHS
SW6 = SW_DIP4.1: 4PIN-SMT-SWT; PART_SPEC: SWITCH; LEVEL: STD; BOARDS: BOTH; PRT_NUM: 6000144; PKG_TYPE: SWT018; ROHS: ROHS
SW15 = SW_DIP4.1: 4PIN-SMT-SWT; PART_SPEC: SWITCH; LEVEL: STD; PRT_NUM: 6000144; BOARDS: BOTH; PKG_TYPE: SWT018; ROHS: ROHS
U21 = ICS_TJA1041.1: CAN-TRANSCEIVER; LEVEL: STD; PRT_NUM: 1000312; BOARDS: BOTH; PKG_TYPE: SOIC14; ROHS: ROHS; WEB: http://www.semiconductors.philips.com/pip/TJA1041T_N1.html
U33 = ICS_TJA1041.1: CAN-TRANSCEIVER; LEVEL: STD; BOARDS: BOTH; PRT_NUM: 1000312; PKG_TYPE: SOIC14; WEB: http://www.semiconductors.philips.com/pip/TJA1041T_N1.html; ROHS: ROHS

## Sheet a0206-2006.11.SchDoc
size 558 x 431 mm
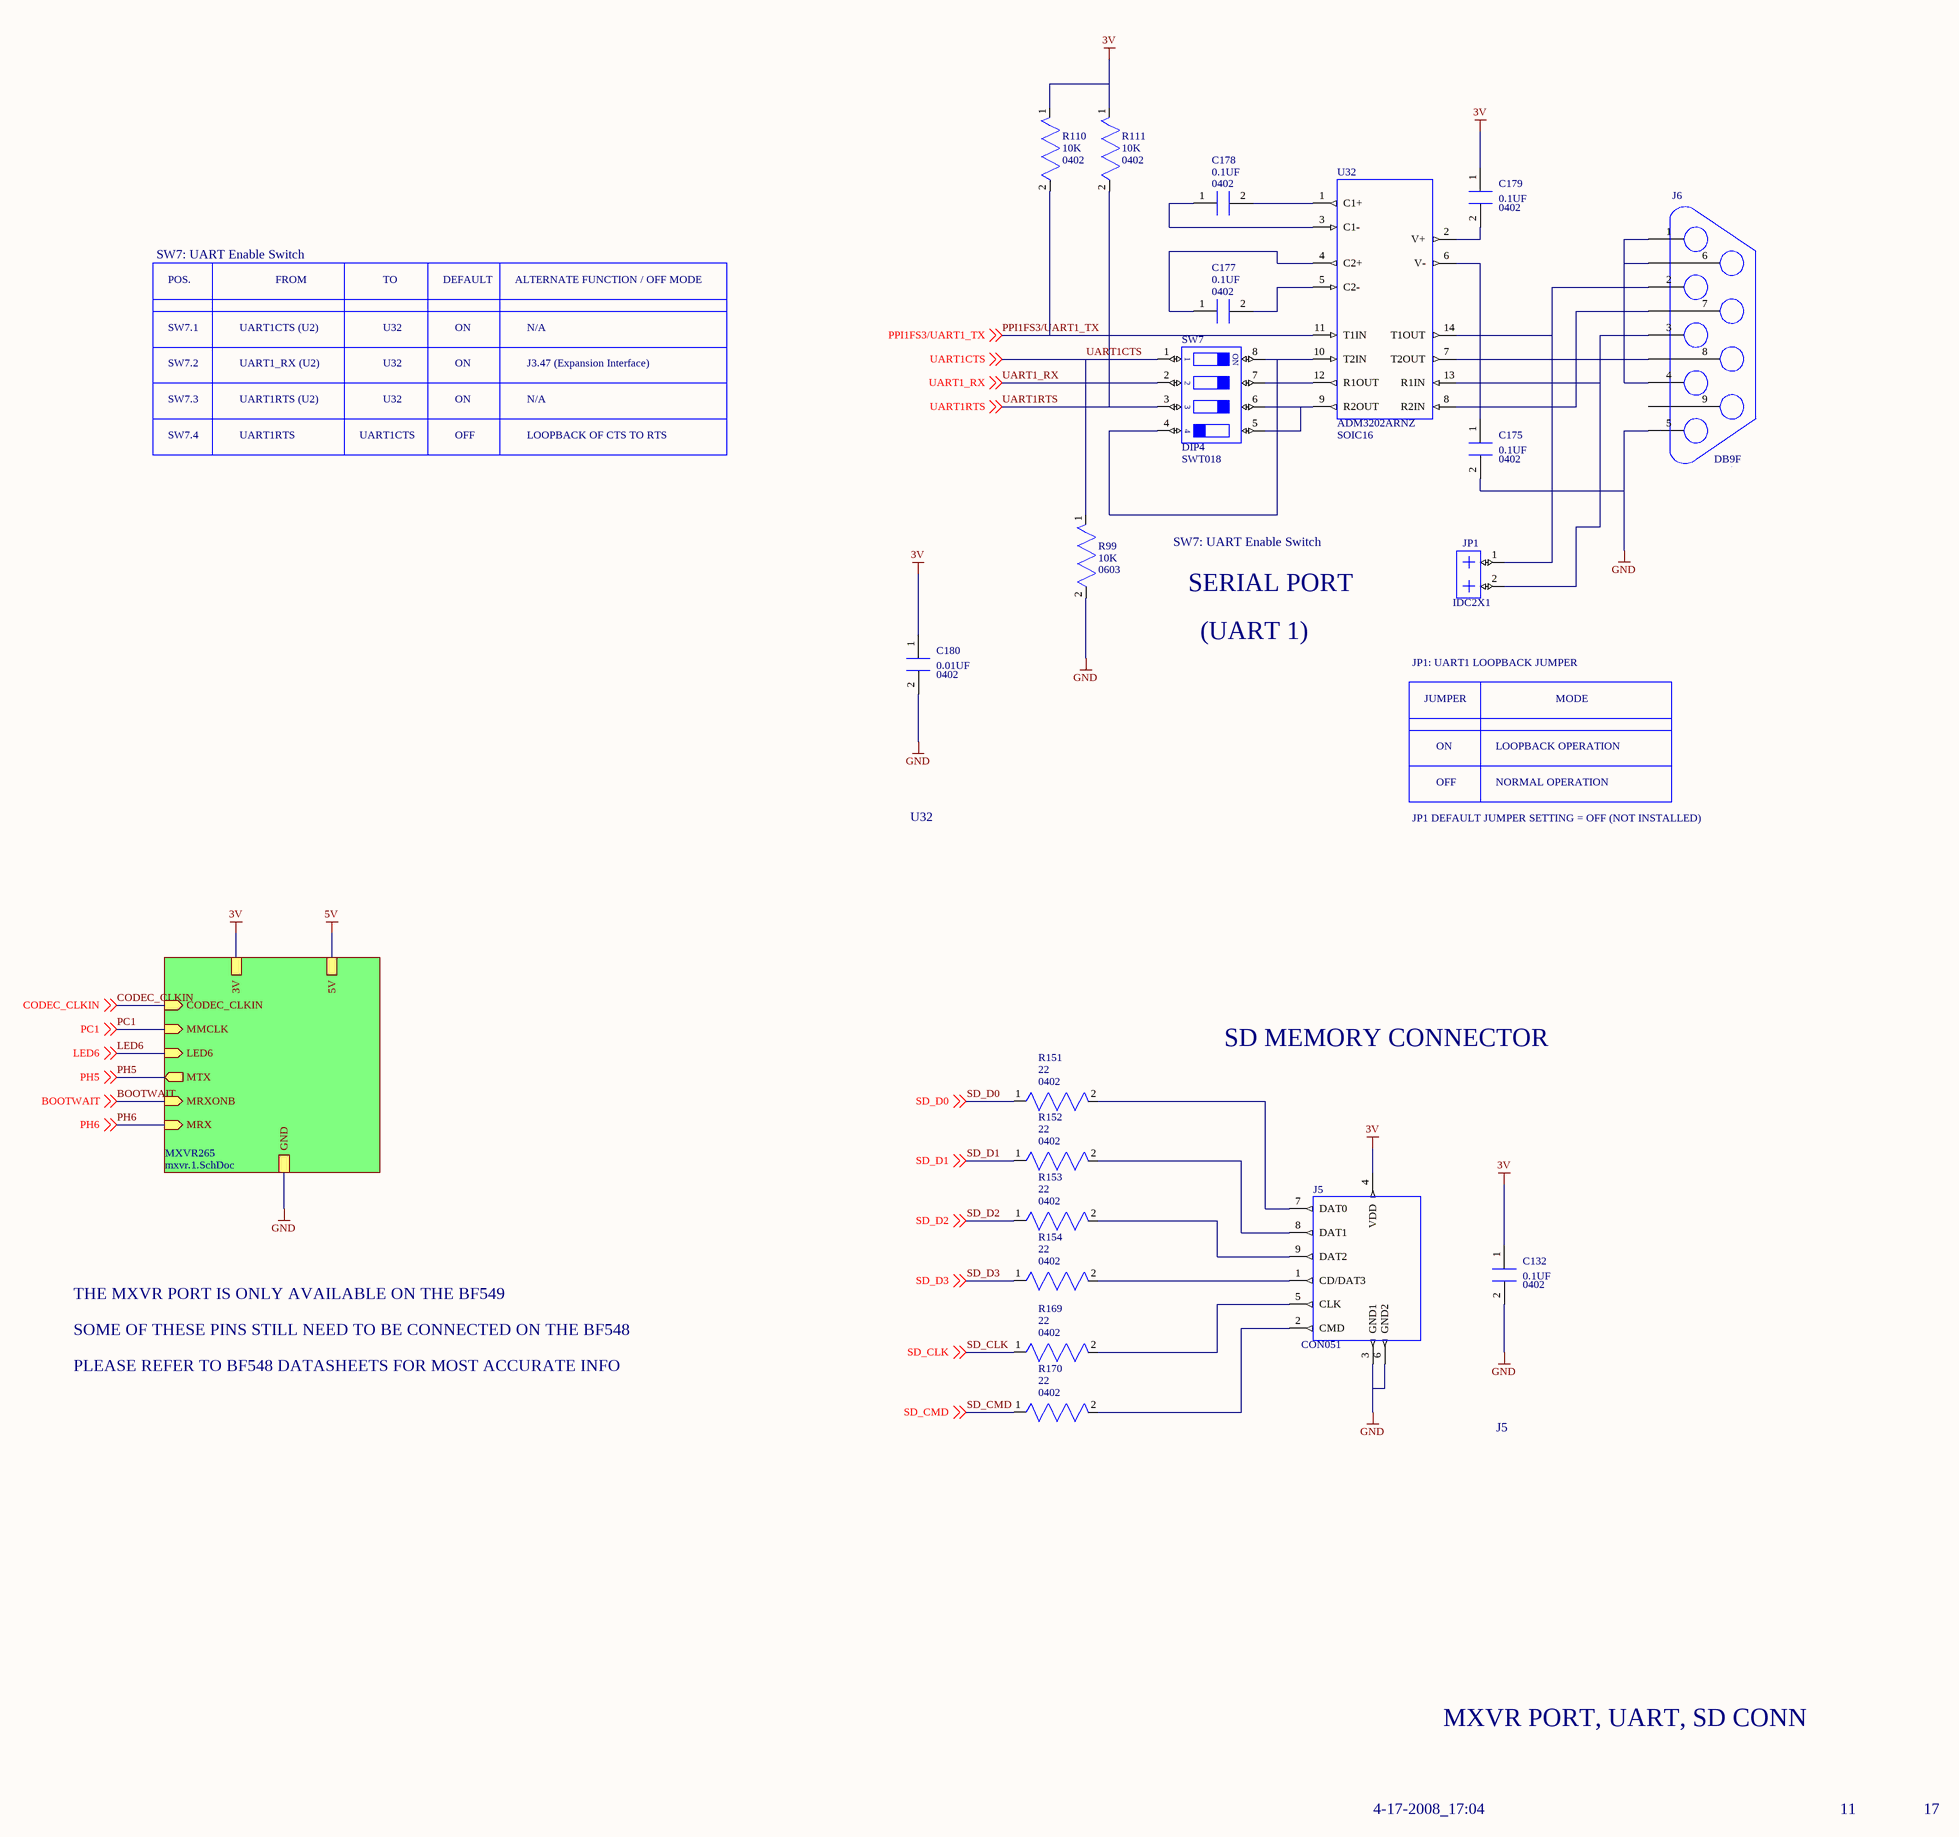
[diagram p32: a0206-2006.11.SchDoc]

### Parts
C132  value 0.1UF  [0402]  (hidden comment: *)
C175  value 0.1UF  [0402]  (hidden comment: *)
C177  value 0.1UF  [0402]  (hidden comment: *)
C178  value 0.1UF  [0402]  (hidden comment: *)
C179  value 0.1UF  [0402]  (hidden comment: *)
C180  value 0.01UF  [0402]  (hidden comment: *)
J5  *  [CON051]  (value not drawn)
J6  *  [DB9F]  (value not drawn)
JP1  *  [IDC2X1]  (value not drawn)
R99  value 10K  [0603]  (hidden comment: *)
R110  value 10K  [0402]  (hidden comment: *)
R111  value 10K  [0402]  (hidden comment: *)
R151  value 22  [0402]  (hidden comment: *)
R152  value 22  [0402]  (hidden comment: *)
R153  value 22  [0402]  (hidden comment: *)
R154  value 22  [0402]  (hidden comment: *)
R169  value 22  [0402]  (hidden comment: *)
R170  value 22  [0402]  (hidden comment: *)
SW7  value DIP4  [SWT018]  (hidden comment: *)
U32  PART: ADM3202ARNZ  [SOIC16]  (hidden comment: *)

### Sub-sheets
MXVR265 = mxvr.1.SchDoc: CODEC_CLKIN (in), GND, LED6 (in), MRX (in), MRXONB (in), MTX (out), MMCLK (in), 3V, 5V

### Nets
3V: C132.1(A) C179.1(A) C180.1(A) J5.4(VDD) R110.1(N1) R111.1(N1) U32.16(3V) ; sheet MXVR265/3V
GND: C132.2(B) C175.2(B) C180.2(B) J5.3(GND1) J5.6(GND2) J6.5 R99.2(N2) U32.15(GND) ; sheet MXVR265/GND
BOOTWAIT: off-sheet BOOTWAIT, sheet MXVR265/MRXONB
CODEC_CLKIN: off-sheet CODEC_CLKIN, sheet MXVR265/CODEC_CLKIN
LED6: off-sheet LED6, sheet MXVR265/LED6
PC1: off-sheet PC1, sheet MXVR265/MMCLK
PH5: off-sheet PH5, sheet MXVR265/MTX
PH6: off-sheet PH6, sheet MXVR265/MRX
PPI1FS3/UART1_TX: R110.2(N2) U32.11(T1IN) ; off-sheet PPI1FS3/UART1_TX
SD_CLK: R169.1(N1) ; off-sheet SD_CLK
SD_CMD: R170.1(N1) ; off-sheet SD_CMD
SD_D0: R151.1(N1) ; off-sheet SD_D0
SD_D1: R152.1(N1) ; off-sheet SD_D1
SD_D2: R153.1(N1) ; off-sheet SD_D2
SD_D3: R154.1(N1) ; off-sheet SD_D3
UART1_RX: SW7.2 ; off-sheet UART1_RX
UART1CTS: R99.1(N1) SW7.1 ; off-sheet UART1CTS
UART1RTS: R111.2(N2) SW7.3 ; off-sheet UART1RTS
NetC175_1: C175.1(A) U32.6(V-)
NetC177_1: C177.1(A) U32.4(C2+)
NetC177_2: C177.2(B) U32.5(C2-)
NetC178_1: C178.1(A) U32.3(C1-)
NetC178_2: C178.2(B) U32.1(C1+)
NetC179_2: C179.2(B) U32.2(V+)
NetJ5_1: J5.1(CD/DAT3) R154.2(N2)
NetJ5_2: J5.2(CMD) R170.2(N2)
NetJ5_5: J5.5(CLK) R169.2(N2)
NetJ5_7: J5.7(DAT0) R151.2(N2)
NetJ5_8: J5.8(DAT1) R152.2(N2)
NetJ5_9: J5.9(DAT2) R153.2(N2)
NetJ6_1: J6.1 J6.4 J6.6
NetJ6_2: J6.2 JP1.1 U32.14(T1OUT)
NetJ6_3: J6.3 JP1.2 U32.13(R1IN)
NetJ6_7: J6.7 U32.8(R2IN)
NetJ6_8: J6.8 U32.7(T2OUT)
NetSW7_4: SW7.4 SW7.8 U32.10(T2IN)
NetSW7_5: SW7.5 SW7.6 U32.9(R2OUT)
NetSW7_7: SW7.7 U32.12(R1OUT)

Not connected (* = marked no-connect by the designer): J6 9

### Notes on the sheet
- SW7: UART Enable Switch
- POS.
- SW7.1
- UART1CTS (U2)
- FROM
- U32
- TO
- DEFAULT
- ON
- ALTERNATE FUNCTION / OFF MODE
- N/A
- SW7.2
- UART1_RX (U2)
- J3.47 (Expansion Interface)
- SW7.3
- SW7.4
- UART1RTS (U2)
- UART1RTS
- UART1CTS
- OFF
- LOOPBACK OF CTS TO RTS
- SERIAL PORT
- (UART 1)
- JP1: UART1 LOOPBACK JUMPER
- JUMPER
- LOOPBACK OPERATION
- MODE
- NORMAL OPERATION
- JP1 DEFAULT JUMPER SETTING = OFF (NOT INSTALLED)
- SD MEMORY CONNECTOR
- THE MXVR PORT IS ONLY AVAILABLE ON THE BF549
- SOME OF THESE PINS STILL NEED TO BE CONNECTED ON THE BF548
- PLEASE REFER TO BF548 DATASHEETS FOR MOST ACCURATE INFO
- J5
- MXVR PORT, UART, SD CONN
- 4-17-2008_17:04
- 11
- 17
- A
- B
- C
- D
- 1
- 2
- 3
- 20 Cotton Road
- 4
- DEVICES
- ANALOG
- Nashua, NH 03063
- PH: 1-800-ANALOGD
- Title
- ADSP-BF548 EZ-KIT LITE
- Size
- Board No.
- A0206-2006
- Rev
- 1.4B
- Date
- Sheet
- of
- (in symbol SW_DIP4.1) ON

### Library data of the parts
C132 = CAP_NON_POLARIZED.2: PART_SPEC: CAPACITOR; LEVEL: STD; TOLERANCE: 10%; VOLTAGE: 10V; PRT_NUM: 7000278; BOARDS: BOTH; TYPE: X5R; PKG_TYPE: 0402; ROHS: ROHS
C175 = CAP_NON_POLARIZED.2: PART_SPEC: CAPACITOR; LEVEL: STD; TYPE: X5R; BOARDS: BOTH; TOLERANCE: 10%; VOLTAGE: 10V; PRT_NUM: 7000278; PKG_TYPE: 0402; ROHS: ROHS
C177 = CAP_NON_POLARIZED.1: PART_SPEC: CAPACITOR; LEVEL: STD; TYPE: X5R; BOARDS: BOTH; TOLERANCE: 10%; VOLTAGE: 10V; PRT_NUM: 7000278; PKG_TYPE: 0402; ROHS: ROHS
C178 = CAP_NON_POLARIZED.1: PART_SPEC: CAPACITOR; LEVEL: STD; TYPE: X5R; BOARDS: BOTH; PRT_NUM: 7000278; VOLTAGE: 10V; TOLERANCE: 10%; PKG_TYPE: 0402; ROHS: ROHS
C179 = CAP_NON_POLARIZED.2: PART_SPEC: CAPACITOR; LEVEL: STD; TYPE: X5R; BOARDS: BOTH; PRT_NUM: 7000278; VOLTAGE: 10V; TOLERANCE: 10%; PKG_TYPE: 0402; ROHS: ROHS
C180 = CAP_NON_POLARIZED.2: as C170 on sheet a0206-2006.10; PKG_TYPE: 0402; ROHS: ROHS
J5 = CON_SD.1: SECURE DIGITAL CARD READE; PART_SPEC: CONNECTOR; LEVEL: STD; CONFIGURATION: 9PIN; PRT_NUM: 6000826; PKG_TYPE: CON051; ROHS: ROHS; TYPE: SD_CONN
J6 = CON_DB9.1: RIGHT ANGLE FEMALE; LEVEL: STD; PRT_NUM: 6000146; CONFIGURATION: 9PIN; PKG_TYPE: DB9F; TYPE: DB9; ROHS: ROHS
JP1 = CON_JP_2X1.1: HEADER; PART_SPEC: CONNECTOR; LEVEL: STD; BOARDS: BOTH; PRT_NUM: 6000774; CONFIGURATION: 2X1; PKG_TYPE: IDC2X1; TYPE: IDC; ROHS: ROHS
R99 = RES_STANDARD.2: PART_SPEC: RESISTOR; LEVEL: STD; POWER: 1/10W; BOARDS: KIT; PRT_NUM: 7000364; TOLERANCE: 5%; PKG_TYPE: 0603; ROHS: ROHS
R110 = RES_STANDARD.2: as R26 on sheet a0206-2006.8; PKG_TYPE: 0402; ROHS: ROHS
R111 = RES_STANDARD.2: as R62 on sheet a0206-2006.8; PKG_TYPE: 0402; ROHS: ROHS
R151 R153 R170 = RES_STANDARD.1: PART_SPEC: RESISTOR; LEVEL: STD; PRT_NUM: 7000284; POWER: 1/16W; TOLERANCE: 5%; PKG_TYPE: 0402; ROHS: ROHS
R152 R154 R169 = RES_STANDARD.1: PART_SPEC: RESISTOR; LEVEL: STD; TOLERANCE: 5%; POWER: 1/16W; PRT_NUM: 7000284; PKG_TYPE: 0402; ROHS: ROHS
SW7 = SW_DIP4.1: as SW6 on sheet a0206-2006.10; PKG_TYPE: SWT018; ROHS: ROHS
U32 = ICS_ADM232AARN.1: RS232 INTERFACE; LEVEL: STD; BOARDS: BOTH; PRT_NUM: 30-025205-01; PKG_TYPE: SOIC16; ROHS: ROHS; WEB: http://www.analog.com/en/prod/0%2C2877%2CADM3202%2C00.html

## Sheet mxvr.1.SchDoc
size 558 x 431 mm
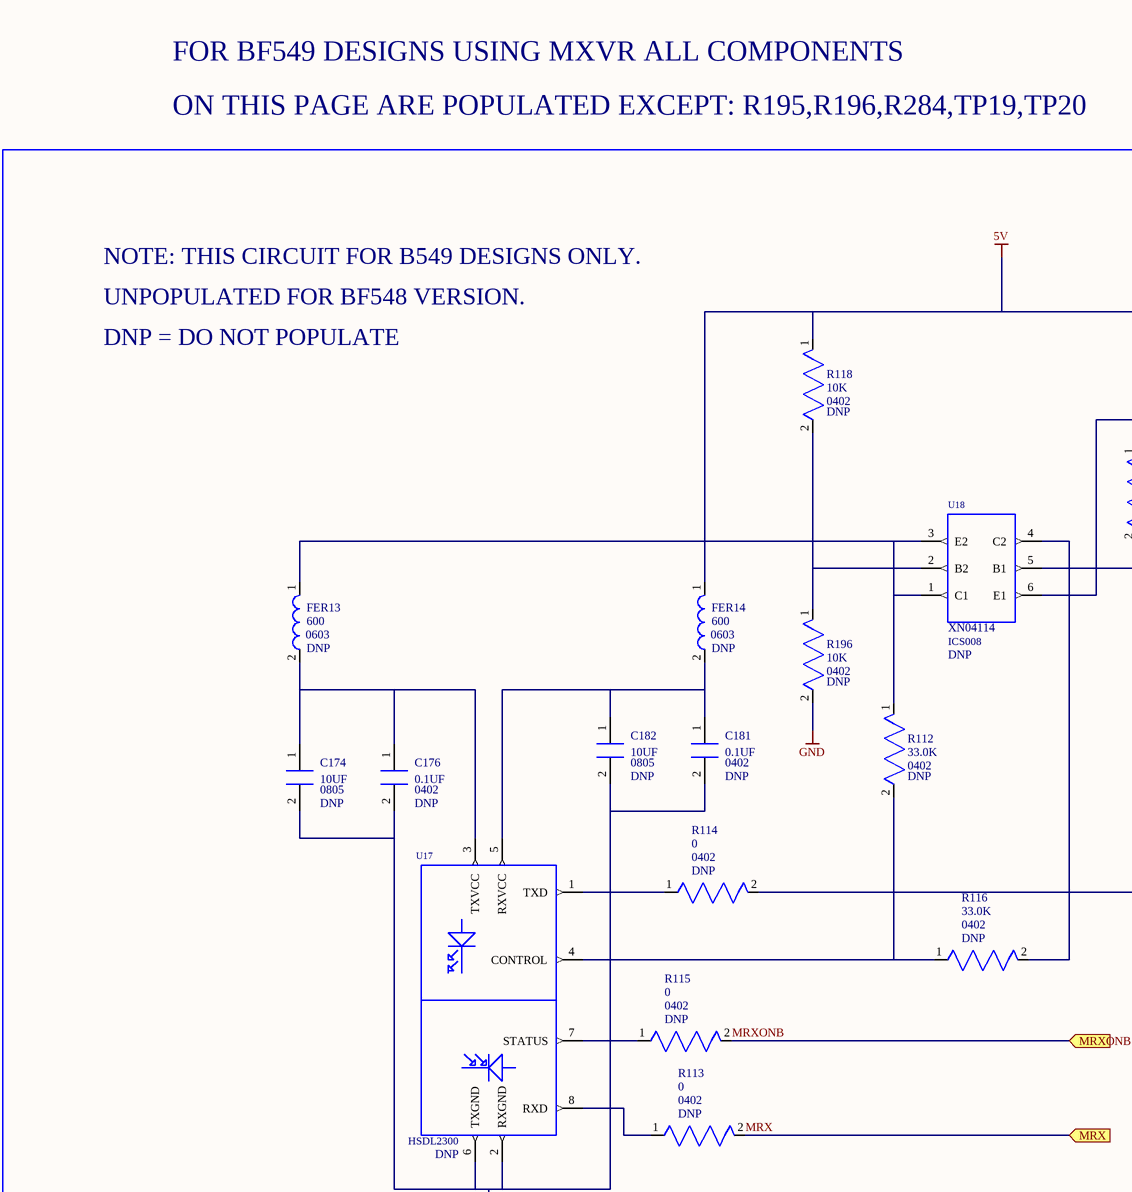
[diagram p33: mxvr.1.SchDoc, top left]
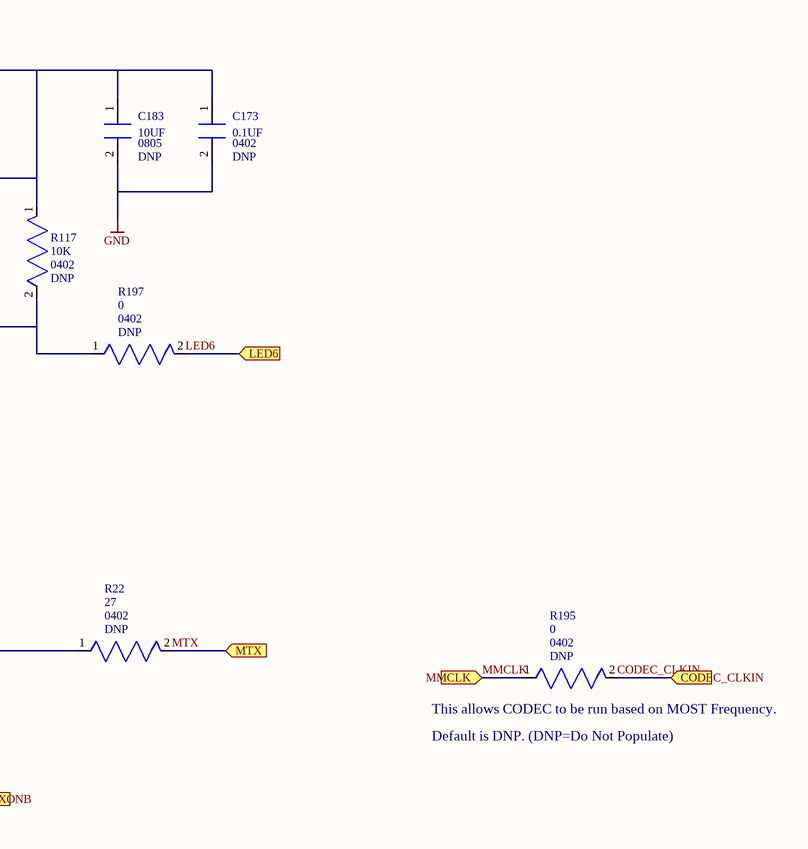
[diagram p34: mxvr.1.SchDoc, top right]
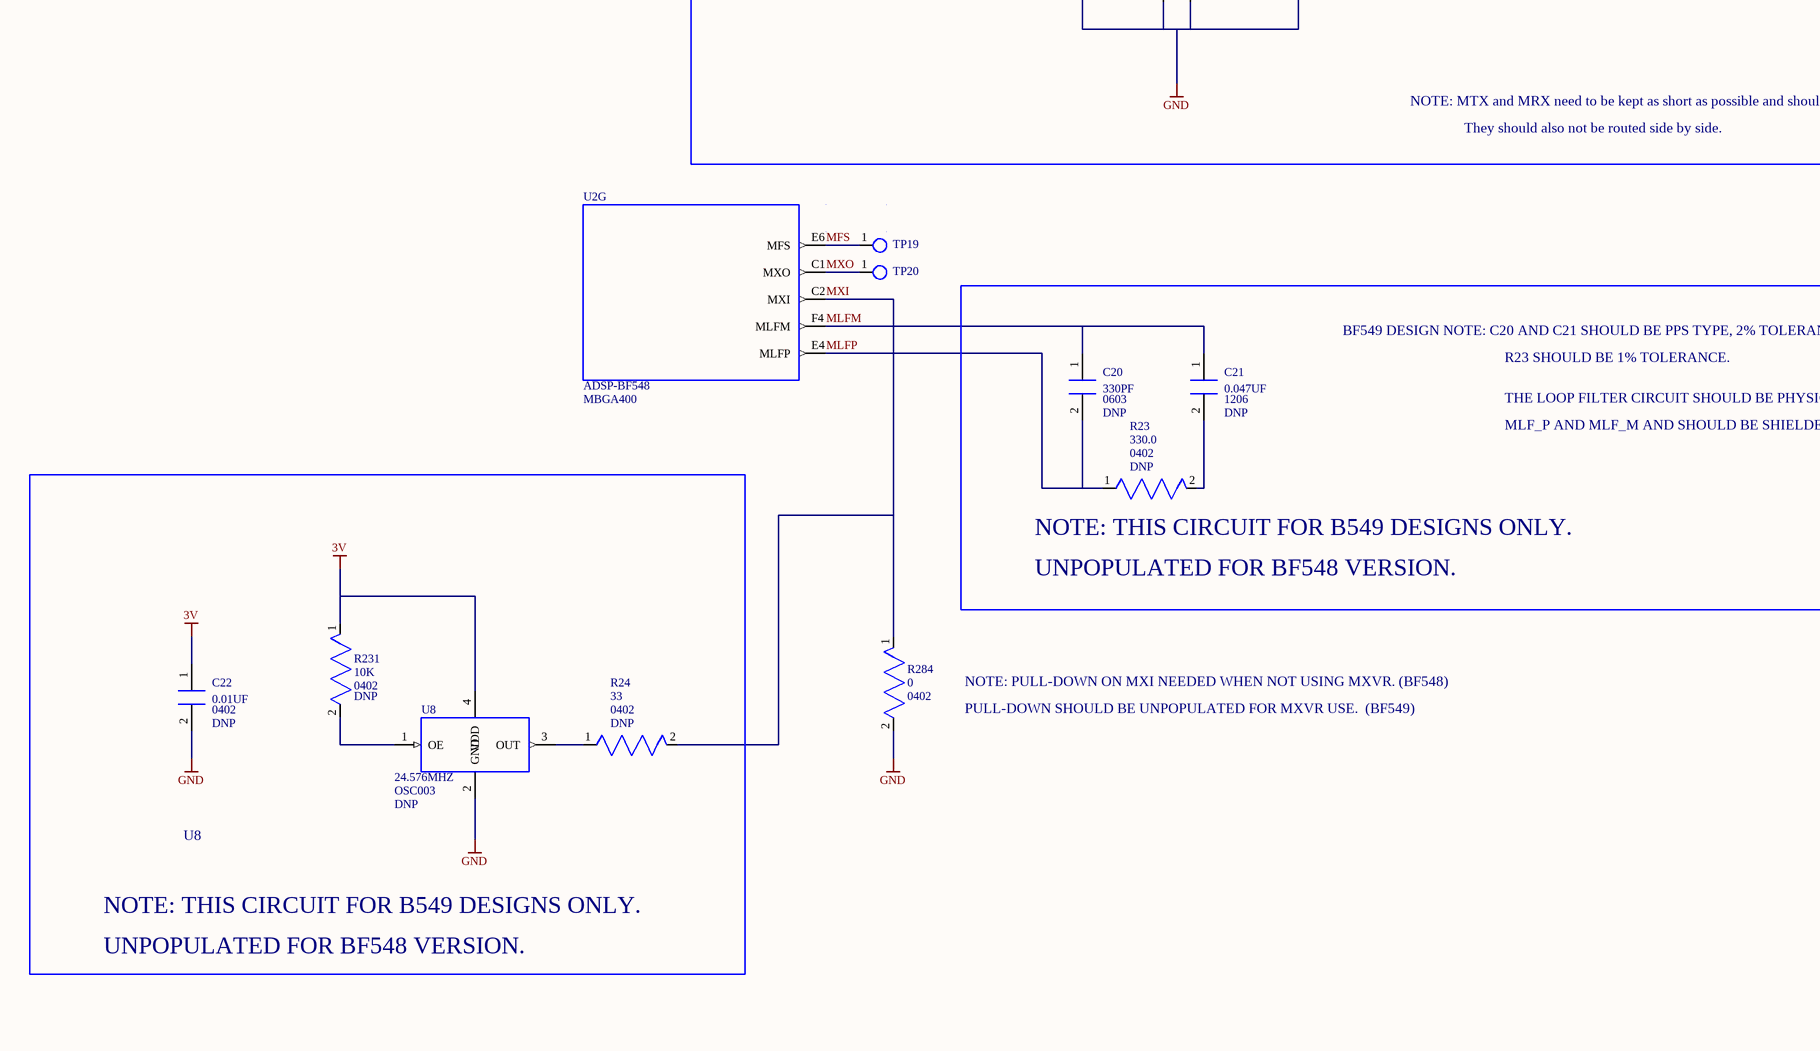
[diagram p35: mxvr.1.SchDoc, bottom left]
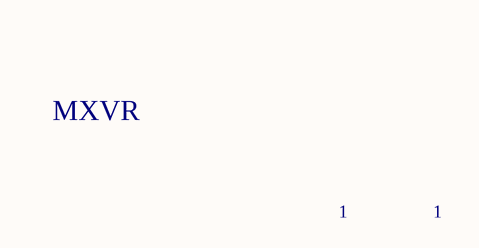
[diagram p36: mxvr.1.SchDoc, bottom right]

### Parts
C20  value 330PF  CLASS: DNP  [0603]  (hidden comment: *)
C21  value 0.047UF  CLASS: DNP  [1206]  (hidden comment: *)
C22  value 0.01UF  CLASS: DNP  [0402]  (hidden comment: *)
C173  value 0.1UF  CLASS: DNP  [0402]  (hidden comment: *)
C174  value 10UF  CLASS: DNP  [0805]  (hidden comment: *)
C176  value 0.1UF  CLASS: DNP  [0402]  (hidden comment: *)
C181  value 0.1UF  CLASS: DNP  [0402]  (hidden comment: *)
C182  value 10UF  CLASS: DNP  [0805]  (hidden comment: *)
C183  value 10UF  CLASS: DNP  [0805]  (hidden comment: *)
FER13  value 600  CLASS: DNP  [0603]  (hidden comment: *)
FER14  value 600  CLASS: DNP  [0603]  (hidden comment: *)
R22  value 27  CLASS: DNP  [0402]  (hidden comment: *)
R23  value 330.0  CLASS: DNP  [0402]  (hidden comment: *)
R24  value 33  CLASS: DNP  [0402]  (hidden comment: *)
R112  value 33.0K  CLASS: DNP  [0402]  (hidden comment: *)
R113  value 0  CLASS: DNP  [0402]  (hidden comment: *)
R114  value 0  CLASS: DNP  [0402]  (hidden comment: *)
R115  value 0  CLASS: DNP  [0402]  (hidden comment: *)
R116  value 33.0K  CLASS: DNP  [0402]  (hidden comment: *)
R117  value 10K  CLASS: DNP  [0402]  (hidden comment: *)
R118  value 10K  CLASS: DNP  [0402]  (hidden comment: *)
R195  value 0  CLASS: DNP  [0402]  (hidden comment: *)
R196  value 10K  CLASS: DNP  [0402]  (hidden comment: *)
R197  value 0  CLASS: DNP  [0402]  (hidden comment: *)
R231  value 10K  CLASS: DNP  [0402]  (hidden comment: *)
R284  value 0  [0402]  (hidden comment: *)
TP19  *  [TP]  (value not drawn)
TP20  *  [TP]  (value not drawn)
U2  PART: ADSP-BF548  PKG_TYPE: MBGA400  (hidden comment: ICS_ADSPBF548)  (part G of 7)
U8  value 24.576MHZ  CLASS: DNP  [OSC003]  (hidden comment: *)
U17  CLASS: DNP  [HSDL2300]  (hidden comment: SPF_MOX_003)
U18  PART: XN04114  CLASS: DNP  [ICS008]  (hidden comment: *)

### Ports
CODEC_CLKIN, LED6, MMCLK, MRX, MRXONB, MTX

### Nets
3V: C22.1(A) R231.1(N1) U8.4(VDD)
5V: C173.1(A) C183.1(A) FER14.1(A) R117.1(N1) R118.1(N1) U18.6(E1)
GND: C22.2(B) C173.2(B) C174.2(B) C176.2(B) C181.2(B) C182.2(B) C183.2(B) R196.2(N2) R284.2(N2) U8.2(GND) U17.2(RXGND) U17.6(TXGND)
CODEC_CLKIN: R195.2(N2) ; port CODEC_CLKIN
LED6: R197.2(N2) ; port LED6
MFS: TP19.1(TP) U2.E6(MFS)
MLFM: C20.1(A) C21.1(A) U2.F4(MLFM)
MLFP: C20.2(B) R23.1(N1) U2.E4(MLFP)
MMCLK: R195.1(N1) ; port MMCLK
MRX: R113.2(N2) ; port MRX
MRXONB: R115.2(N2) ; port MRXONB
MTX: R22.2(N2) ; port MTX
MXI: R24.2(N2) R284.1(N1) U2.C2(MXI)
MXO: TP20.1(TP) U2.C1(MXO)
NetC21_2: C21.2(B) R23.2(N2)
NetC174_1: C174.1(A) C176.1(A) FER13.2(B) U17.3(TXVCC)
NetC181_1: C181.1(A) C182.1(A) FER14.2(B) U17.5(RXVCC)
NetFER13_1: FER13.1(A) R112.1(N1) U18.1(C1) U18.3(E2)
NetR22_1: R22.1(N1) R114.2(N2)
NetR24_1: R24.1(N1) U8.3(OUT)
NetR112_2: R112.2(N2) R116.1(N1) U17.4(CONTROL)
NetR113_1: R113.1(N1) U17.8(RXD)
NetR114_1: R114.1(N1) U17.1(TXD)
NetR115_1: R115.1(N1) U17.7(STATUS)
NetR116_2: R116.2(N2) U18.4(C2)
NetR117_2: R117.2(N2) R197.1(N1) U18.5(B1)
NetR118_2: R118.2(N2) R196.1(N1) U18.2(B2)
NetR231_2: R231.2(N2) U8.1(OE)

### Notes on the sheet
- FOR BF549 DESIGNS USING MXVR ALL COMPONENTS
- ON THIS PAGE ARE POPULATED EXCEPT: R195,R196,R284,TP19,TP20
- NOTE: THIS CIRCUIT FOR B549 DESIGNS ONLY.
- UNPOPULATED FOR BF548 VERSION.
- DNP = DO NOT POPULATE
- (near R195) This allows CODEC to be run based on MOST Frequency.
- (near R195) Default is DNP. (DNP=Do Not Populate)
- NOTE: MTX and MRX need to be kept as short as possible and should be shielded.
- They should also not be routed side by side.
- BF549 DESIGN NOTE: C20 AND C21 SHOULD BE PPS TYPE, 2% TOLERANCE.
- R23 SHOULD BE 1% TOLERANCE.
- THE LOOP FILTER CIRCUIT SHOULD BE PHYSICALLY CLOSE TO
- MLF_P AND MLF_M AND SHOULD BE SHIELDED USING GNDMP.
- (near R23) NOTE: THIS CIRCUIT FOR B549 DESIGNS ONLY.
- NOTE: PULL-DOWN ON MXI NEEDED WHEN NOT USING MXVR. (BF548)
- PULL-DOWN SHOULD BE UNPOPULATED FOR MXVR USE.  (BF549)
- U8
- MXVR
- 1
- A
- B
- C
- D
- 2
- 3
- 20 Cotton Road
- 4
- DEVICES
- ANALOG
- Nashua, NH 03063
- PH: 1-800-ANALOGD
- Title
- ADSP-BF548 EZ-KIT LITE
- Size
- Board No.
- A0206-2006
- Rev
- 1.4B
- Date
- Sheet
- of

### Library data of the parts
C20 = CAP_NON_POLARIZED.2: PART_SPEC: CAPACITOR; LEVEL: STD; PRT_NUM: 7000577; TYPE: PPS; VOLTAGE: 16V; TOLERANCE: 2%; PKG_TYPE: 0603; ROHS: ROHS
C21 = CAP_NON_POLARIZED.2: PART_SPEC: CAPACITOR; LEVEL: STD; PRT_NUM: 7000578; TYPE: PPS; VOLTAGE: 16V; TOLERANCE: 2%; PKG_TYPE: 1206; ROHS: ROHS
C22 = CAP_NON_POLARIZED.2: PART_SPEC: CAPACITOR; LEVEL: STD; PRT_NUM: 7000279; VOLTAGE: 16V; TOLERANCE: 10%; BOARDS: BOTH; TYPE: X7R; PKG_TYPE: 0402; ROHS: ROHS
C173 C181 = CAP_NON_POLARIZED.2: PART_SPEC: CAPACITOR; LEVEL: STD; PRT_NUM: 7000278; TYPE: X5R; VOLTAGE: 10V; TOLERANCE: 10%; PKG_TYPE: 0402; ROHS: ROHS
C174 C183 = CAP_NON_POLARIZED.2: PART_SPEC: CAPACITOR; LEVEL: STD; TOLERANCE: 10%; VOLTAGE: 10V; TYPE: X5R CER; PRT_NUM: 7000461; PKG_TYPE: 0805; ROHS: ROHS
C176 = CAP_NON_POLARIZED.2: PART_SPEC: CAPACITOR; LEVEL: STD; TOLERANCE: 10%; VOLTAGE: 10V; TYPE: X5R; PRT_NUM: 7000278; PKG_TYPE: 0402; ROHS: ROHS
C182 = CAP_NON_POLARIZED.2: PART_SPEC: CAPACITOR; LEVEL: STD; PRT_NUM: 7000461; TYPE: X5R CER; VOLTAGE: 10V; TOLERANCE: 10%; PKG_TYPE: 0805; ROHS: ROHS
FER13 = FER_STANDARD.2: PART_SPEC: FERRITE; LEVEL: STD; CURRENT: 200MA; FREQ: 100MHZ; PRT_NUM: 7000112; PKG_TYPE: 0603; ROHS: ROHS
FER14 = FER_STANDARD.2: PART_SPEC: FERRITE; LEVEL: STD; PRT_NUM: 7000112; FREQ: 100MHZ; CURRENT: 200MA; PKG_TYPE: 0603; ROHS: ROHS
R22 = RES_STANDARD.1: PART_SPEC: RESISTOR; LEVEL: STD; PRT_NUM: 7000579; TOLERANCE: 5%; BOARDS: BOTH; POWER: 1/16W; PKG_TYPE: 0402; ROHS: ROHS
R23 = RES_STANDARD.1: PART_SPEC: RESISTOR; LEVEL: STD; PRT_NUM: 7000565; POWER: 1/16W; TOLERANCE: 1%; PKG_TYPE: 0402; ROHS: ROHS
R24 = RES_STANDARD.1: PART_SPEC: RESISTOR; LEVEL: STD; PRT_NUM: 7000285; TOLERANCE: 5%; BOARDS: BOTH; POWER: 1/16W; PKG_TYPE: 0402; ROHS: ROHS
R112 = RES_STANDARD.2: PART_SPEC: RESISTOR; LEVEL: STD; TOLERANCE: 1%; POWER: 1/16W; PRT_NUM: 7000566; PKG_TYPE: 0402; ROHS: ROHS
R113 R115 R195 = RES_STANDARD.1: PART_SPEC: RESISTOR; LEVEL: STD; TOLERANCE: 5%; POWER: 1/16W; PRT_NUM: 7000282; PKG_TYPE: 0402; ROHS: ROHS
R114 R197 = RES_STANDARD.1: PART_SPEC: RESISTOR; LEVEL: STD; PRT_NUM: 7000282; POWER: 1/16W; TOLERANCE: 5%; PKG_TYPE: 0402; ROHS: ROHS
R116 = RES_STANDARD.1: PART_SPEC: RESISTOR; LEVEL: STD; PRT_NUM: 7000566; POWER: 1/16W; TOLERANCE: 1%; PKG_TYPE: 0402; ROHS: ROHS
R117 R231 = RES_STANDARD.2: PART_SPEC: RESISTOR; LEVEL: STD; PRT_NUM: 7000280; TOLERANCE: 5%; BOARDS: BOTH; POWER: 1/16W; PKG_TYPE: 0402; ROHS: ROHS
R118 = RES_STANDARD.2: PART_SPEC: RESISTOR; LEVEL: STD; PRT_NUM: 7000280; POWER: 1/16W; TOLERANCE: 5%; PKG_TYPE: 0402; ROHS: ROHS
R196 = RES_STANDARD.2: PART_SPEC: RESISTOR; LEVEL: STD; TOLERANCE: 5%; POWER: 1/16W; PRT_NUM: 7000280; PKG_TYPE: 0402; ROHS: ROHS
R284 = RES_STANDARD.2: PART_SPEC: RESISTOR; LEVEL: STD; POWER: 1/16W; BOARDS: BOTH; TOLERANCE: 5%; PRT_NUM: 7000282; PKG_TYPE: 0402; ROHS: ROHS
TP19 TP20 = MSC_TEST_POINT.2: TESTPOINT; CLASS: DNP; LEVEL: STD; PART_SPEC: TESTPOINT; PART: TESTPOINT; ROHS: ROHS; PKG_TYPE: TP
U2 = ICS_ADSPBF548_A: 600 MHZ; LEVEL: MXVR; PRT_NUM: 30-025548-02; DEVICE: ICS_ADSPBF548; ROHS: ROHS; WEB: http://www.analog.com/en/prod/0,2877,ADSP%252DBF548,00.html
U8 = OSC_SMT_OE.2: OSCILLATOR; LEVEL: MXVR; PRT_NUM: 1000340; PART_SPEC: OSCILLATOR; PKG_TYPE: OSC003; ROHS: ROHS
U17 = CON_MOST.1: LEVEL: STD; PRT_NUM: 6000848; DEVICE: SPF_MOX_003; PKG_TYPE: HSDL2300
U18 = ICS_XN4114.1: DUAL PNP; LEVEL: STD; PRT_NUM: 1000425; PKG_TYPE: ICS008; ROHS: ROHS; WEB: http://www.semicon.panasonic.co.jp/ds/eng/SJJ00047BED.pdf

## Sheet a0206-2006.12.SchDoc
size 558 x 431 mm
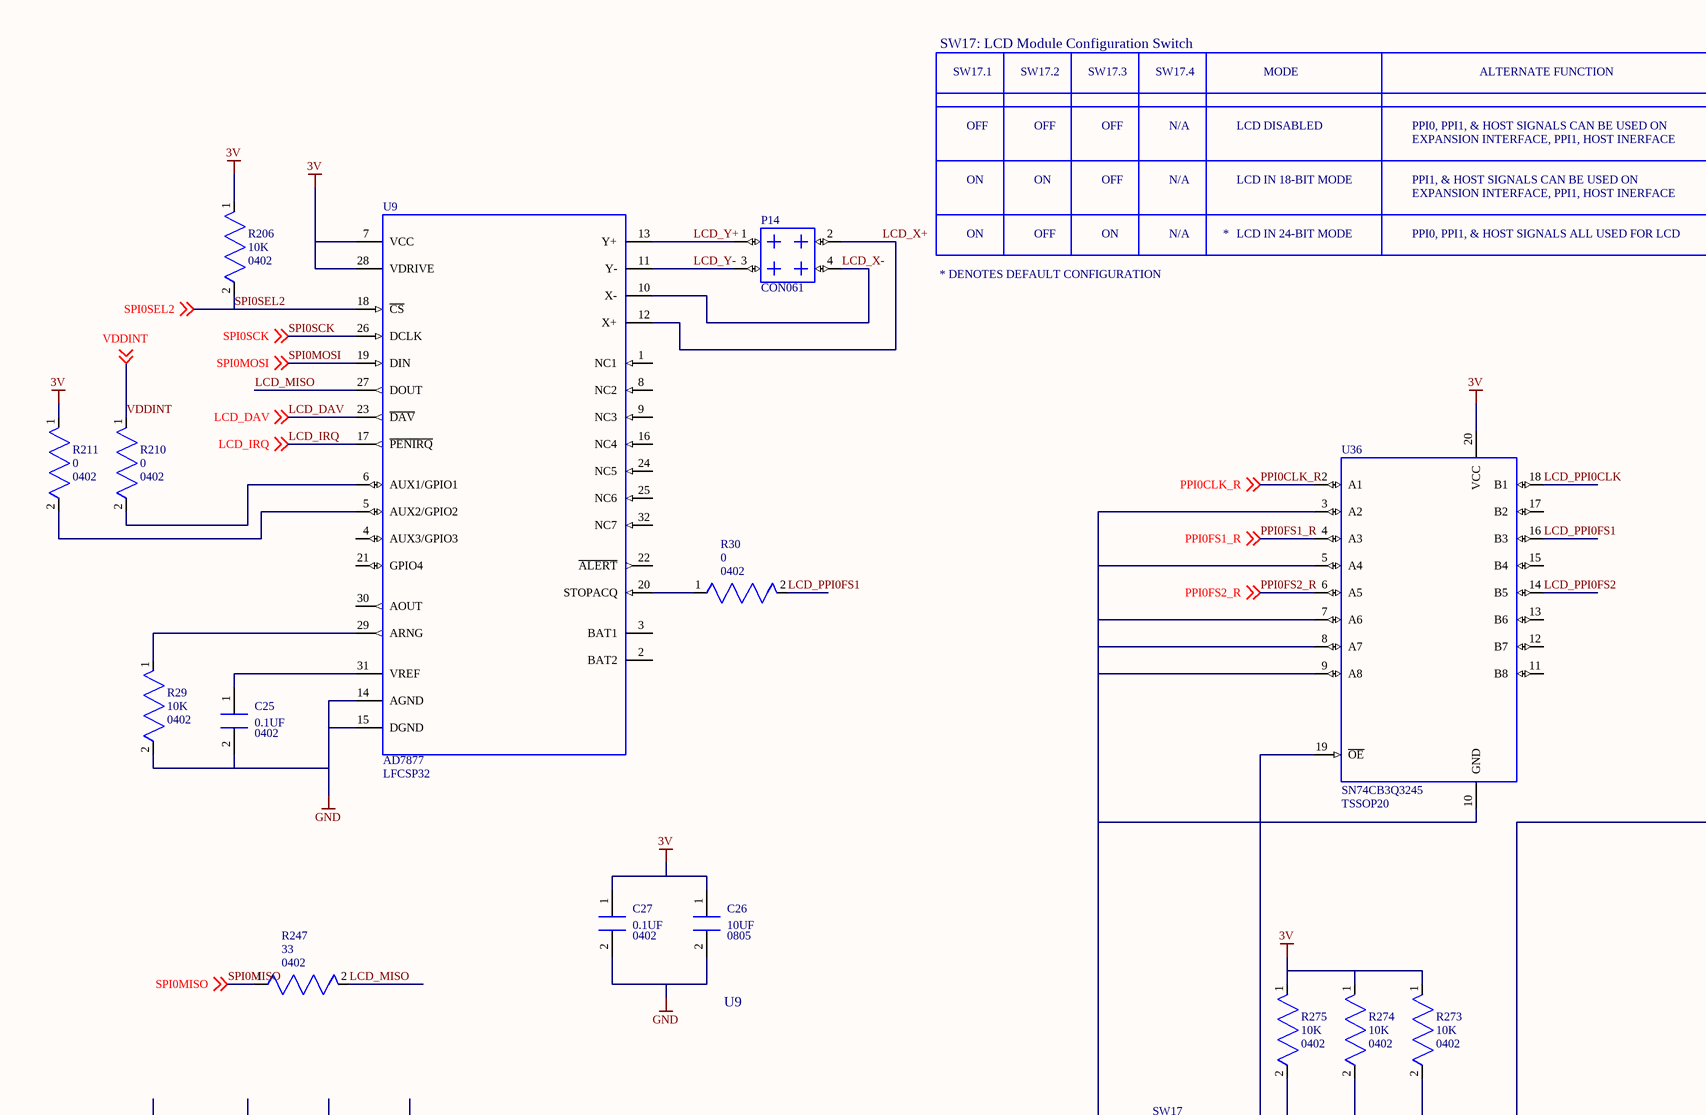
[diagram p37: a0206-2006.12.SchDoc, top left]
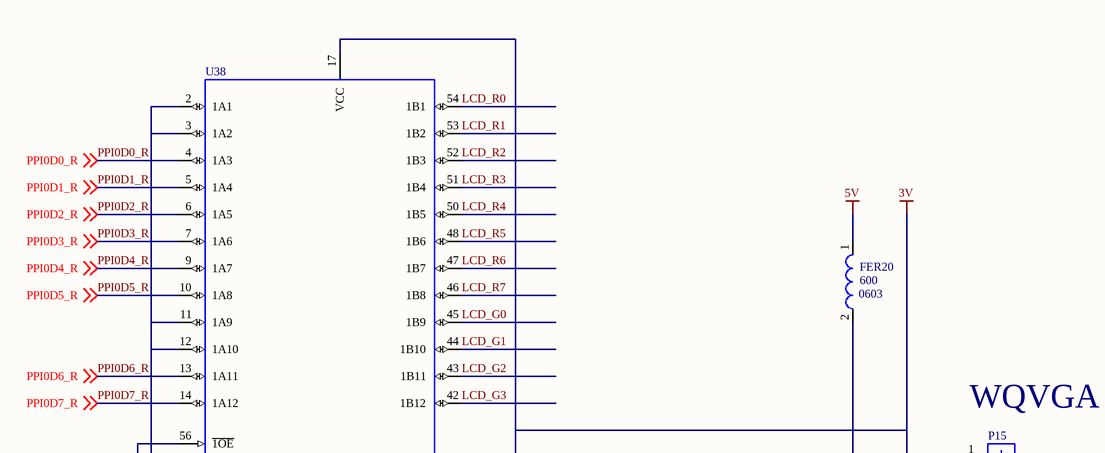
[diagram p38: a0206-2006.12.SchDoc, top right]
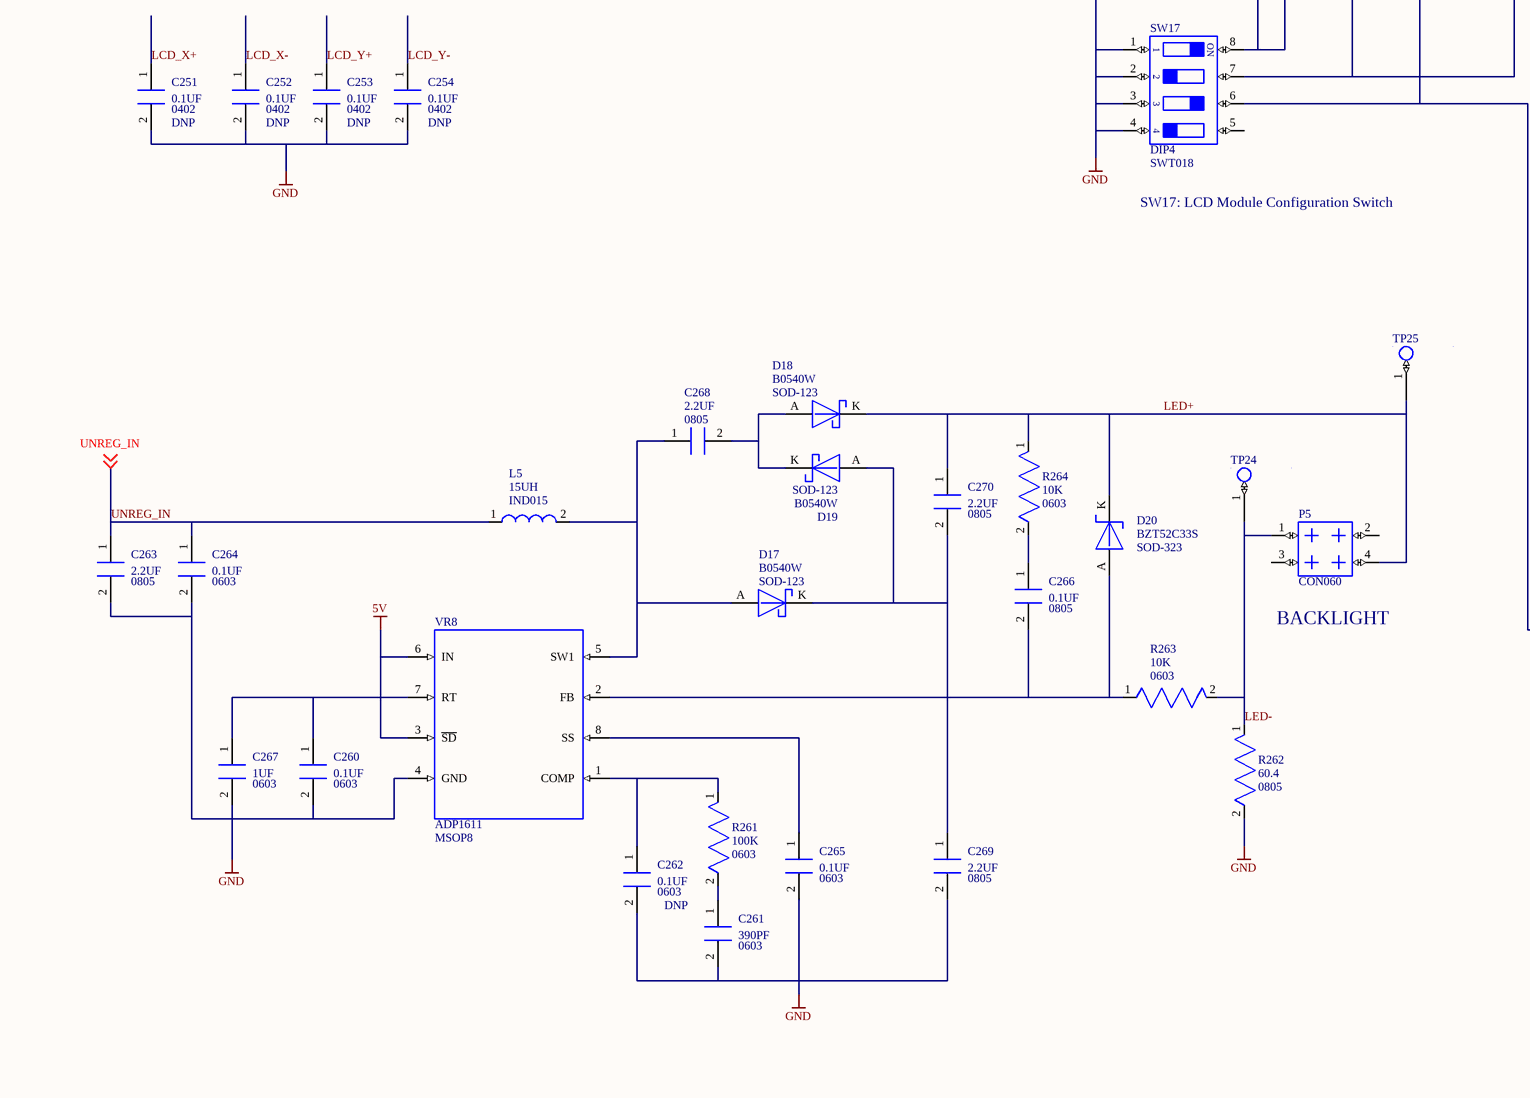
[diagram p39: a0206-2006.12.SchDoc, bottom left]
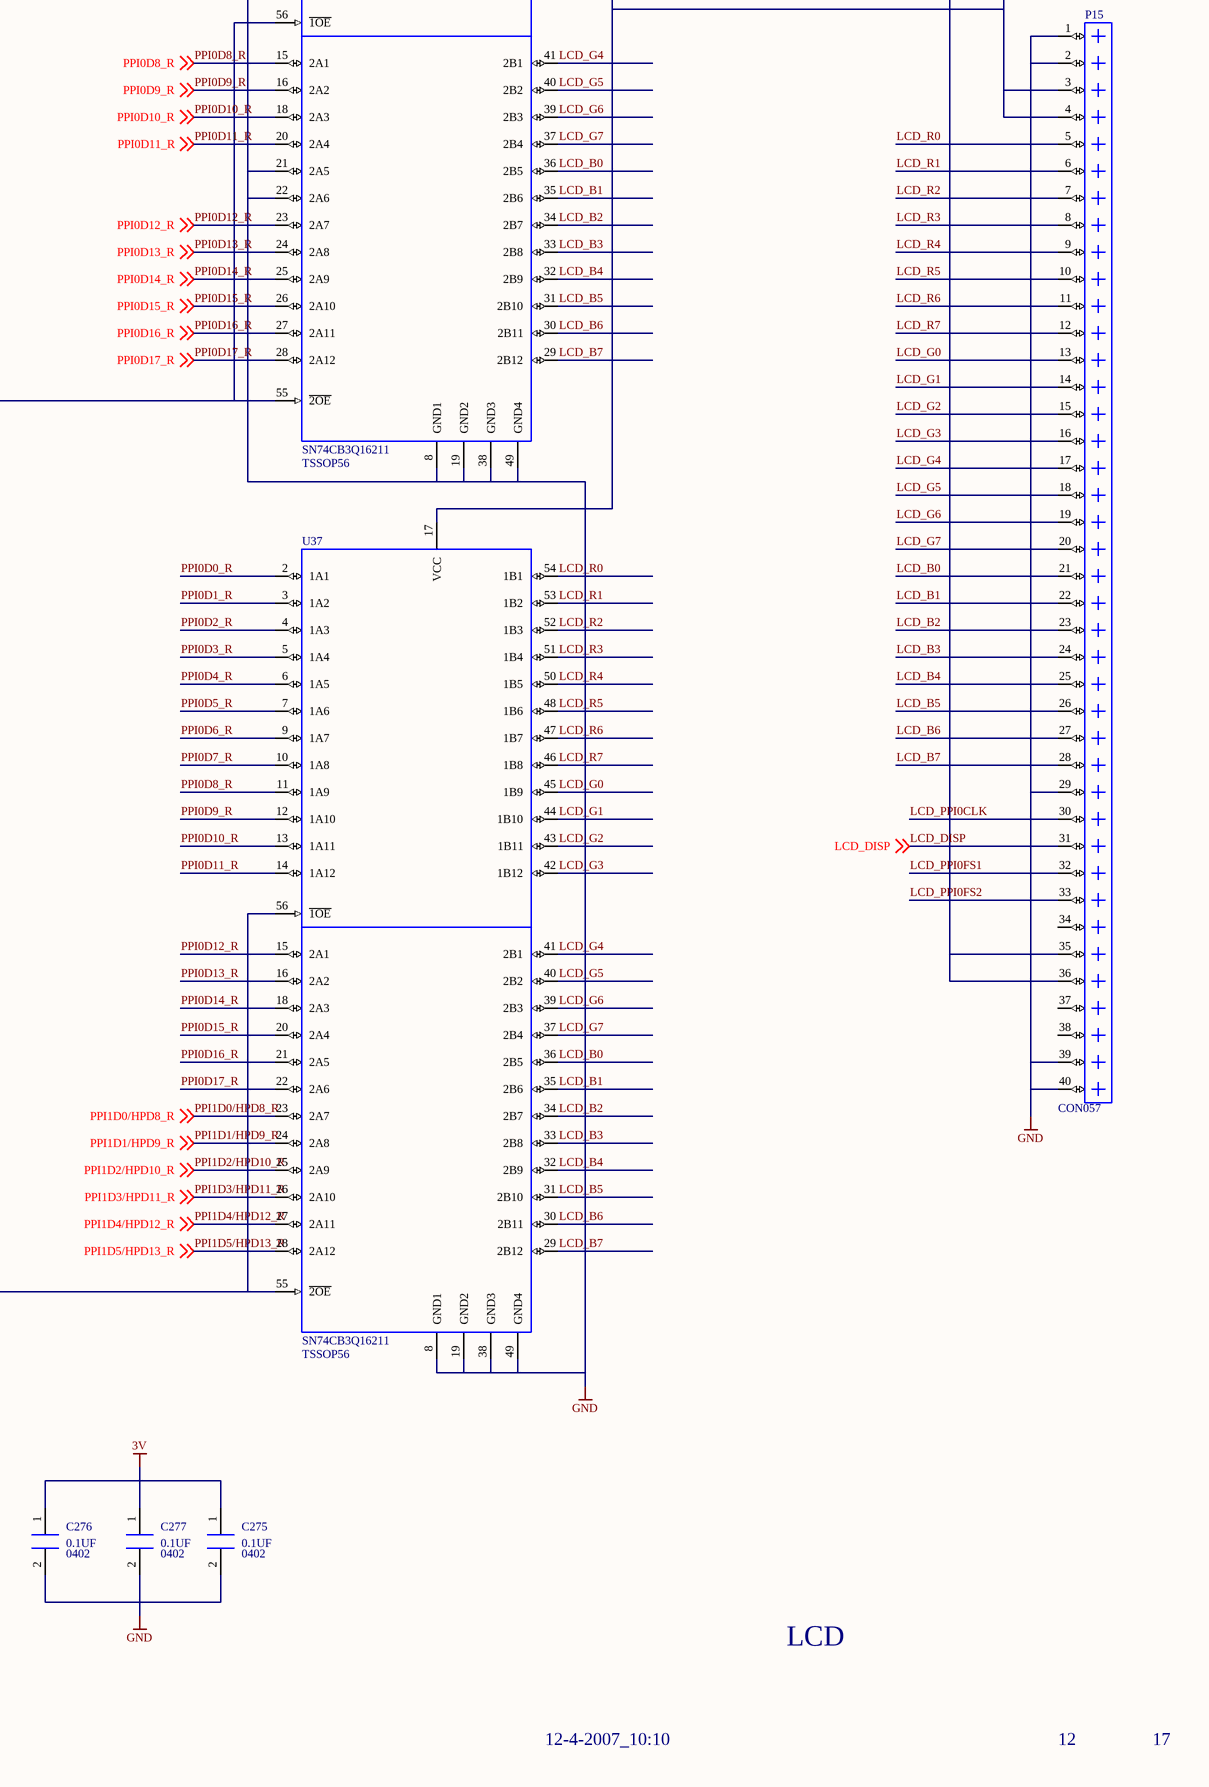
[diagram p40: a0206-2006.12.SchDoc, bottom right]

### Parts
C25  value 0.1UF  [0402]  (hidden comment: *)
C26  value 10UF  [0805]  (hidden comment: *)
C27  value 0.1UF  [0402]  (hidden comment: *)
C251  value 0.1UF  CLASS: DNP  [0402]  (hidden comment: *)
C252  value 0.1UF  CLASS: DNP  [0402]  (hidden comment: *)
C253  value 0.1UF  CLASS: DNP  [0402]  (hidden comment: *)
C254  value 0.1UF  CLASS: DNP  [0402]  (hidden comment: *)
C260  value 0.1UF  [0603]  (hidden comment: *)
C261  value 390PF  [0603]  (hidden comment: *)
C262  value 0.1UF  CLASS: DNP  [0603]  (hidden comment: *)
C263  value 2.2UF  [0805]  (hidden comment: *)
C264  value 0.1UF  [0603]  (hidden comment: *)
C265  value 0.1UF  [0603]  (hidden comment: *)
C266  value 0.1UF  [0805]  (hidden comment: *)
C267  value 1UF  [0603]  (hidden comment: *)
C268  value 2.2UF  [0805]  (hidden comment: *)
C269  value 2.2UF  [0805]  (hidden comment: *)
C270  value 2.2UF  [0805]  (hidden comment: *)
C275  value 0.1UF  [0402]  (hidden comment: *)
C276  value 0.1UF  [0402]  (hidden comment: *)
C277  value 0.1UF  [0402]  (hidden comment: *)
D17  PART: B0540W  [SOD-123]  (hidden comment: *)
D18  PART: B0540W  [SOD-123]  (hidden comment: *)
D19  PART: B0540W  [SOD-123]  (hidden comment: *)
D20  PART: BZT52C33S  [SOD-323]  (hidden comment: *)
FER20  value 600  [0603]  (hidden comment: *)
L5  value 15UH  [IND015]  (hidden comment: *)
P5  *  [CON060]  (value not drawn)
P14  *  [CON061]  (value not drawn)
P15  *  [CON057]  (value not drawn)
R29  value 10K  [0402]  (hidden comment: *)
R30  value 0  [0402]  (hidden comment: *)
R206  value 10K  [0402]  (hidden comment: *)
R210  value 0  [0402]  (hidden comment: *)
R211  value 0  [0402]  (hidden comment: *)
R247  value 33  [0402]  (hidden comment: *)
R261  value 100K  [0603]  (hidden comment: *)
R262  value 60.4  [0805]  (hidden comment: *)
R263  value 10K  [0603]  (hidden comment: *)
R264  value 10K  [0603]  (hidden comment: *)
R273  value 10K  [0402]  (hidden comment: *)
R274  value 10K  [0402]  (hidden comment: *)
R275  value 10K  [0402]  (hidden comment: *)
SW17  value DIP4  [SWT018]  (hidden comment: *)
TP24  *  [TP]  (value not drawn)
TP25  *  [TP]  (value not drawn)
U9  PART: AD7877  [LFCSP32]  (hidden comment: *)
U36  PART: SN74CB3Q3245  [TSSOP20]  (hidden comment: *)
U37  PART: SN74CB3Q16211  [TSSOP56]  (hidden comment: *)
U38  PART: SN74CB3Q16211  [TSSOP56]  (hidden comment: *)
VR8  PART: ADP1611  [MSOP8]  (hidden comment: *)

### Nets
3V: C26.1(A) C27.1(A) C275.1(A) C276.1(A) C277.1(A) P15.3 P15.4 R206.1(N1) R211.1(N1) R273.1(N1) R274.1(N1) R275.1(N1) U9.7(VCC) U9.28(VDRIVE) U36.20(VCC) U37.17(VCC) U38.17(VCC)
5V: C260.1(A) C267.1(A) FER20.1(A) VR8.3(~{SD}) VR8.6(IN) VR8.7(RT)
GND: C25.2(B) C26.2(B) C27.2(B) C251.2(B) C252.2(B) C253.2(B) C254.2(B) C260.2(B) C261.2(B) C262.2(B) C263.2(B) C264.2(B) C265.2(B) C267.2(B) C269.2(B) C275.2(B) C276.2(B) C277.2(B) P15.1 P15.2 P15.29 P15.39 P15.40 R29.2(N2) R262.2(N2) SW17.1 SW17.2 SW17.3 SW17.4 U9.14(AGND) U9.15(DGND) U9.33(GND) U36.3(A2) U36.5(A4) U36.7(A6) U36.8(A7) U36.9(A8) U36.10(GND) U37.8(GND1) U37.19(GND2) U37.38(GND3) U37.49(GND4) U38.2(1A1) U38.3(1A2) U38.8(GND1) U38.11(1A9) U38.12(1A10) U38.19(GND2) U38.21(2A5) U38.22(2A6) U38.38(GND3) U38.49(GND4) VR8.4(GND)
LCD_B0: P15.21 U37.36(2B5) U38.36(2B5)
LCD_B1: P15.22 U37.35(2B6) U38.35(2B6)
LCD_B2: P15.23 U37.34(2B7) U38.34(2B7)
LCD_B3: P15.24 U37.33(2B8) U38.33(2B8)
LCD_B4: P15.25 U37.32(2B9) U38.32(2B9)
LCD_B5: P15.26 U37.31(2B10) U38.31(2B10)
LCD_B6: P15.27 U37.30(2B11) U38.30(2B11)
LCD_B7: P15.28 U37.29(2B12) U38.29(2B12)
LCD_DAV: U9.23(~{DAV}) ; off-sheet LCD_DAV
LCD_DISP: P15.31 ; off-sheet LCD_DISP
LCD_G0: P15.13 U37.45(1B9) U38.45(1B9)
LCD_G1: P15.14 U37.44(1B10) U38.44(1B10)
LCD_G2: P15.15 U37.43(1B11) U38.43(1B11)
LCD_G3: P15.16 U37.42(1B12) U38.42(1B12)
LCD_G4: P15.17 U37.41(2B1) U38.41(2B1)
LCD_G5: P15.18 U37.40(2B2) U38.40(2B2)
LCD_G6: P15.19 U37.39(2B3) U38.39(2B3)
LCD_G7: P15.20 U37.37(2B4) U38.37(2B4)
LCD_IRQ: U9.17(~{PENIRQ}) ; off-sheet LCD_IRQ
LCD_MISO: R247.2(N2) U9.27(DOUT)
LCD_PPI0CLK: P15.30 U36.18(B1)
LCD_PPI0FS1: P15.32 R30.2(N2) U36.16(B3)
LCD_PPI0FS2: P15.33 U36.14(B5)
LCD_R0: P15.5 U37.54(1B1) U38.54(1B1)
LCD_R1: P15.6 U37.53(1B2) U38.53(1B2)
LCD_R2: P15.7 U37.52(1B3) U38.52(1B3)
LCD_R3: P15.8 U37.51(1B4) U38.51(1B4)
LCD_R4: P15.9 U37.50(1B5) U38.50(1B5)
LCD_R5: P15.10 U37.48(1B6) U38.48(1B6)
LCD_R6: P15.11 U37.47(1B7) U38.47(1B7)
LCD_R7: P15.12 U37.46(1B8) U38.46(1B8)
LCD_X+: C251.1(A) P14.2 U9.12(X+)
LCD_X-: C252.1(A) P14.4 U9.10(X-)
LCD_Y+: C253.1(A) P14.1 U9.13(Y+)
LCD_Y-: C254.1(A) P14.3 U9.11(Y-)
LED+: C270.1(A) D18.K(CATHODE) D20.K(CATHODE) P5.4 R264.1(N1) TP25.1(TP)
LED-: P5.1 R262.1(N1) R263.2(N2) TP24.1(TP)
PPI0CLK_R: U36.2(A1) ; off-sheet PPI0CLK_R
PPI0D0_R: U37.2(1A1) U38.4(1A3) ; off-sheet PPI0D0_R
PPI0D1_R: U37.3(1A2) U38.5(1A4) ; off-sheet PPI0D1_R
PPI0D2_R: U37.4(1A3) U38.6(1A5) ; off-sheet PPI0D2_R
PPI0D3_R: U37.5(1A4) U38.7(1A6) ; off-sheet PPI0D3_R
PPI0D4_R: U37.6(1A5) U38.9(1A7) ; off-sheet PPI0D4_R
PPI0D5_R: U37.7(1A6) U38.10(1A8) ; off-sheet PPI0D5_R
PPI0D6_R: U37.9(1A7) U38.13(1A11) ; off-sheet PPI0D6_R
PPI0D7_R: U37.10(1A8) U38.14(1A12) ; off-sheet PPI0D7_R
PPI0D8_R: U37.11(1A9) U38.15(2A1) ; off-sheet PPI0D8_R
PPI0D9_R: U37.12(1A10) U38.16(2A2) ; off-sheet PPI0D9_R
PPI0D10_R: U37.13(1A11) U38.18(2A3) ; off-sheet PPI0D10_R
PPI0D11_R: U37.14(1A12) U38.20(2A4) ; off-sheet PPI0D11_R
PPI0D12_R: U37.15(2A1) U38.23(2A7) ; off-sheet PPI0D12_R
PPI0D13_R: U37.16(2A2) U38.24(2A8) ; off-sheet PPI0D13_R
PPI0D14_R: U37.18(2A3) U38.25(2A9) ; off-sheet PPI0D14_R
PPI0D15_R: U37.20(2A4) U38.26(2A10) ; off-sheet PPI0D15_R
PPI0D16_R: U37.21(2A5) U38.27(2A11) ; off-sheet PPI0D16_R
PPI0D17_R: U37.22(2A6) U38.28(2A12) ; off-sheet PPI0D17_R
PPI0FS1_R: U36.4(A3) ; off-sheet PPI0FS1_R
PPI0FS2_R: U36.6(A5) ; off-sheet PPI0FS2_R
PPI1D0/HPD8_R: U37.23(2A7) ; off-sheet PPI1D0/HPD8_R
PPI1D1/HPD9_R: U37.24(2A8) ; off-sheet PPI1D1/HPD9_R
PPI1D2/HPD10_R: U37.25(2A9) ; off-sheet PPI1D2/HPD10_R
PPI1D3/HPD11_R: U37.26(2A10) ; off-sheet PPI1D3/HPD11_R
PPI1D4/HPD12_R: U37.27(2A11) ; off-sheet PPI1D4/HPD12_R
PPI1D5/HPD13_R: U37.28(2A12) ; off-sheet PPI1D5/HPD13_R
SPI0MISO: R247.1(N1) ; off-sheet SPI0MISO
SPI0MOSI: U9.19(DIN) ; off-sheet SPI0MOSI
SPI0SCK: U9.26(DCLK) ; off-sheet SPI0SCK
SPI0SEL2: R206.2(N2) U9.18(~{CS}) ; off-sheet SPI0SEL2
UNREG_IN: C263.1(A) C264.1(A) L5.1(A) ; off-sheet UNREG_IN
VDDINT: R210.1(N1) ; off-sheet VDDINT
NetC25_1: C25.1(A) U9.31(VREF)
NetC261_1: C261.1(A) R261.2(N2)
NetC262_1: C262.1(A) R261.1(N1) VR8.1(COMP)
NetC265_1: C265.1(A) VR8.8(SS)
NetC266_1: C266.1(A) R264.2(N2)
NetC266_2: C266.2(B) D20.A(ANODE) R263.1(N1) VR8.2(FB)
NetC268_1: C268.1(A) D17.A(ANODE) L5.2(B) VR8.5(SW1)
NetC268_2: C268.2(B) D18.A(ANODE) D19.K(CATHODE)
NetC269_1: C269.1(A) C270.2(B) D17.K(CATHODE) D19.A(ANODE)
NetFER20_2: FER20.2(B) P15.35 P15.36
NetR29_1: R29.1(N1) U9.29(ARNG)
NetR30_1: R30.1(N1) U9.20(STOPACQ)
NetR210_2: R210.2(N2) U9.6(AUX1/GPIO1)
NetR211_2: R211.2(N2) U9.5(AUX2/GPIO2)
NetR273_2: R273.2(N2) SW17.6 U37.55(~{2OE}) U37.56(~{1OE})
NetR274_2: R274.2(N2) SW17.7 U38.55(~{2OE}) U38.56(~{1OE})
NetR275_2: R275.2(N2) SW17.8 U36.19(~{OE})

Not connected (* = marked no-connect by the designer): P5 2 3 5 6; P14 5 6; P15 34 37 38; SW17 5; U9 1(NC1) 2(BAT2) 3(BAT1) 4(AUX3/GPIO3) 8(NC2) 9(NC3) 16(NC4) 21(GPIO4) 22(~{ALERT}) 24(NC5) 25(NC6) 30(AOUT) 32(NC7); U36 1 11(B8) 12(B7) 13(B6) 15(B4) 17(B2); U37 1; U38 1

### Notes on the sheet
- SW17: LCD Module Configuration Switch
- SW17.1
- SW17.2
- SW17.3
- SW17.4
- MODE
- ALTERNATE FUNCTION
- OFF
- N/A
- LCD DISABLED
- PPI0, PPI1, & HOST SIGNALS CAN BE USED ON
- EXPANSION INTERFACE, PPI1, HOST INERFACE
- ON
- LCD IN 18-BIT MODE
- PPI1, & HOST SIGNALS CAN BE USED ON
- * DENOTES DEFAULT CONFIGURATION
- *
- LCD IN 24-BIT MODE
- PPI0, PPI1, & HOST SIGNALS ALL USED FOR LCD
- (near P15) WQVGA
- U9
- (near P5) BACKLIGHT
- LCD
- 12-4-2007_10:10
- 12
- 17
- A
- B
- C
- D
- 1
- 2
- 3
- 20 Cotton Road
- 4
- DEVICES
- ANALOG
- Nashua, NH 03063
- PH: 1-800-ANALOGD
- Title
- ADSP-BF548 EZ-KIT LITE
- Size
- Board No.
- A0206-2006
- Rev
- 1.4B
- Date
- Sheet
- of
- (in symbol SW_DIP4.1) ON

### Library data of the parts
C25 C251 C253 C277 = CAP_NON_POLARIZED.2: PART_SPEC: CAPACITOR; LEVEL: STD; TOLERANCE: 10%; VOLTAGE: 10V; PRT_NUM: 7000278; BOARDS: BOTH; TYPE: X5R; PKG_TYPE: 0402; ROHS: ROHS
C26 = CAP_NON_POLARIZED.2: PART_SPEC: CAPACITOR; LEVEL: STD; TOLERANCE: 10%; VOLTAGE: 6.3V; PRT_NUM: 7000265; BOARDS: BOTH; TYPE: X5R; PKG_TYPE: 0805; ROHS: ROHS
C27 C252 C254 C275 C276 = CAP_NON_POLARIZED.2: PART_SPEC: CAPACITOR; LEVEL: STD; TYPE: X5R; BOARDS: BOTH; PRT_NUM: 7000278; VOLTAGE: 10V; TOLERANCE: 10%; PKG_TYPE: 0402; ROHS: ROHS
C260 C262 C264 C265 = CAP_NON_POLARIZED.2: PART_SPEC: CAPACITOR; LEVEL: STD; TOLERANCE: 10%; VOLTAGE: 16V; TYPE: X7R; PRT_NUM: 7000340; PKG_TYPE: 0603; ROHS: ROHS
C261 = CAP_NON_POLARIZED.2: PART_SPEC: CAPACITOR; LEVEL: STD; TOLERANCE: 5%; VOLTAGE: 25V; TYPE: NPO; PRT_NUM: 7000437; PKG_TYPE: 0603; ROHS: ROHS
C263 C269 C270 = CAP_NON_POLARIZED.2: PART_SPEC: CAPACITOR; LEVEL: STD; TOLERANCE: 10%; VOLTAGE: 25V; TYPE: X7R; PRT_NUM: 7000607; PKG_TYPE: 0805; ROHS: ROHS
C266 = CAP_NON_POLARIZED.2: PART_SPEC: CAPACITOR; LEVEL: STD; TOLERANCE: 10%; VOLTAGE: 50V; TYPE: X7R; PRT_NUM: 7000034; PKG_TYPE: 0805; ROHS: ROHS
C267 = CAP_NON_POLARIZED.2: PART_SPEC: CAPACITOR; LEVEL: STD; PRT_NUM: 7000574; TYPE: X5S; VOLTAGE: 50V; TOLERANCE: 10%; PKG_TYPE: 0603; ROHS: ROHS
C268 = CAP_NON_POLARIZED.1: PART_SPEC: CAPACITOR; LEVEL: STD; TOLERANCE: 10%; VOLTAGE: 25V; TYPE: X7R; PRT_NUM: 7000607; PKG_TYPE: 0805; ROHS: ROHS
D17-D19 = DIO_SCHOTTKY.1: SCHOTTKY BARRIER RECTIFIE; LEVEL: STD; CURRENT: .5A; PRT_NUM: 7000605; PKG_TYPE: SOD-123; WEB: http://www.diodes.com/products/catalog/detail.php?item-id; ROHS: ROHS
D20 = DIO_ZENER2P.1: ZENER; LEVEL: STD; CURRENT: .5A; PRT_NUM: 7000606; PKG_TYPE: SOD-323; WEB: http://www.diodes.com/products/catalog/detail.php?item-id; ROHS: ROHS
FER20 = FER_STANDARD.2: as FER13 on sheet mxvr.1; PKG_TYPE: 0603; ROHS: ROHS
L5 = IND_STANDARD.1: PART_SPEC: INDUCTOR; LEVEL: STD; TOLERANCE: 20%; PRT_NUM: 7000604; PKG_TYPE: IND015; ROHS: ROHS
P5 = CON_LCD_BACKLIGHT_LQ043T3DX02.1: 0.5MM LCD CONNECTOR; NC: 5,6; LEVEL: STD; PRT_NUM: 6000837; CONFIGURATION: 4PIN; PART_SPEC: CONNECTOR; PKG_TYPE: CON060; TYPE: FPC; ROHS: ROHS
P14 = CON_LCD_TOUCH_LQ043T3DX02.1: 1.0MM LCD CONNECTOR; NC: 5,6; LEVEL: STD; CONFIGURATION: 4PIN; PRT_NUM: 6000838; PART_SPEC: CONNECTOR; PKG_TYPE: CON061; ROHS: ROHS; TYPE: FPC
P15 = CON_40X1.1: 0.5MM LCD CONNECTOR; LEVEL: STD; CONFIGURATION: 40PIN; PRT_NUM: 6000834; PART_SPEC: CONNECTOR; PKG_TYPE: CON057; ROHS: ROHS; TYPE: FPC
R29 R273 R275 = RES_STANDARD.2: as R117 on sheet mxvr.1; PKG_TYPE: 0402; ROHS: ROHS
R30 = RES_STANDARD.1: as R114 on sheet mxvr.1; PKG_TYPE: 0402; ROHS: ROHS
R206 R274 = RES_STANDARD.2: PART_SPEC: RESISTOR; LEVEL: STD; POWER: 1/16W; BOARDS: BOTH; TOLERANCE: 5%; PRT_NUM: 7000280; PKG_TYPE: 0402; ROHS: ROHS
R210 = RES_STANDARD.2: PART_SPEC: RESISTOR; LEVEL: STD; POWER: 1/16W; TOLERANCE: 5%; PRT_NUM: 7000282; PKG_TYPE: 0402; ROHS: ROHS
R211 = RES_STANDARD.2: PART_SPEC: RESISTOR; LEVEL: STD; PRT_NUM: 7000282; TOLERANCE: 5%; POWER: 1/16W; PKG_TYPE: 0402; ROHS: ROHS
R247 = RES_STANDARD.1: PART_SPEC: RESISTOR; LEVEL: STD; TOLERANCE: 5%; POWER: 1/16W; PRT_NUM: 7000285; PKG_TYPE: 0402; ROHS: ROHS
R261 = RES_STANDARD.2: PART_SPEC: RESISTOR; LEVEL: STD; TOLERANCE: 5%; POWER: 1/10W; PRT_NUM: 7000367; PKG_TYPE: 0603; ROHS: ROHS
R262 = RES_STANDARD.2: PART_SPEC: RESISTOR; LEVEL: STD; PRT_NUM: 7000603; POWER: 1/8W; TOLERANCE: 1%; PKG_TYPE: 0805; ROHS: ROHS
R263 = RES_STANDARD.1: PART_SPEC: RESISTOR; LEVEL: STD; PRT_NUM: 7000364; POWER: 1/10W; TOLERANCE: 5%; PKG_TYPE: 0603; ROHS: ROHS
R264 = RES_STANDARD.2: PART_SPEC: RESISTOR; LEVEL: STD; TOLERANCE: 5%; POWER: 1/10W; PRT_NUM: 7000364; PKG_TYPE: 0603; ROHS: ROHS
SW17 = SW_DIP4.1: 4PIN-SMT-SWT; PART_SPEC: SWITCH; LEVEL: STD; PRT_NUM: 6000144; BOARDS: KIT; PKG_TYPE: SWT018; ROHS: ROHS
TP24 TP25 = MSC_TEST_POINT.1: TESTPOINT; CLASS: DNP; LEVEL: STD; PART_SPEC: TESTPOINT; PART: TESTPOINT; ROHS: ROHS; PKG_TYPE: TP
U9 = ICS_AD7877.1: TOUCH SCREEN CONTROLLER; LEVEL: STD; PRT_NUM: 30-025761-01; PKG_TYPE: LFCSP32; ROHS: ROHS; WEB: http://www.analog.com/en/prod/0%2C2877%2CAD7877%2C00.html
U36 = ICS_SN74CB3Q3245.1: 8-BIT BUS SWITCH; NC: 1; LEVEL: STD; PRT_NUM: 1000439; PKG_TYPE: TSSOP20; ROHS: ROHS; WEB: http://focus.ti.com/docs/prod/folders/print/sn74cb3q3245.html
U37 U38 = ICS_SN74CB3Q16211.1: 24-BIT BUS SWITCH; NC: 1; LEVEL: STD; PRT_NUM: 1000438; PKG_TYPE: TSSOP56; ROHS: ROHS; WEB: http://focus.ti.com/docs/prod/folders/print/sn74cb3q16211.html
VR8 = ICS_ADP1611.1: STEP-UP-DC-DC CONVERTER; LEVEL: STD; PRT_NUM: 30-025763-01; PKG_TYPE: MSOP8; WEB: http://www.analog.com/en/prod/0,,766_824_ADP1611,00.html; ROHS: ROHS